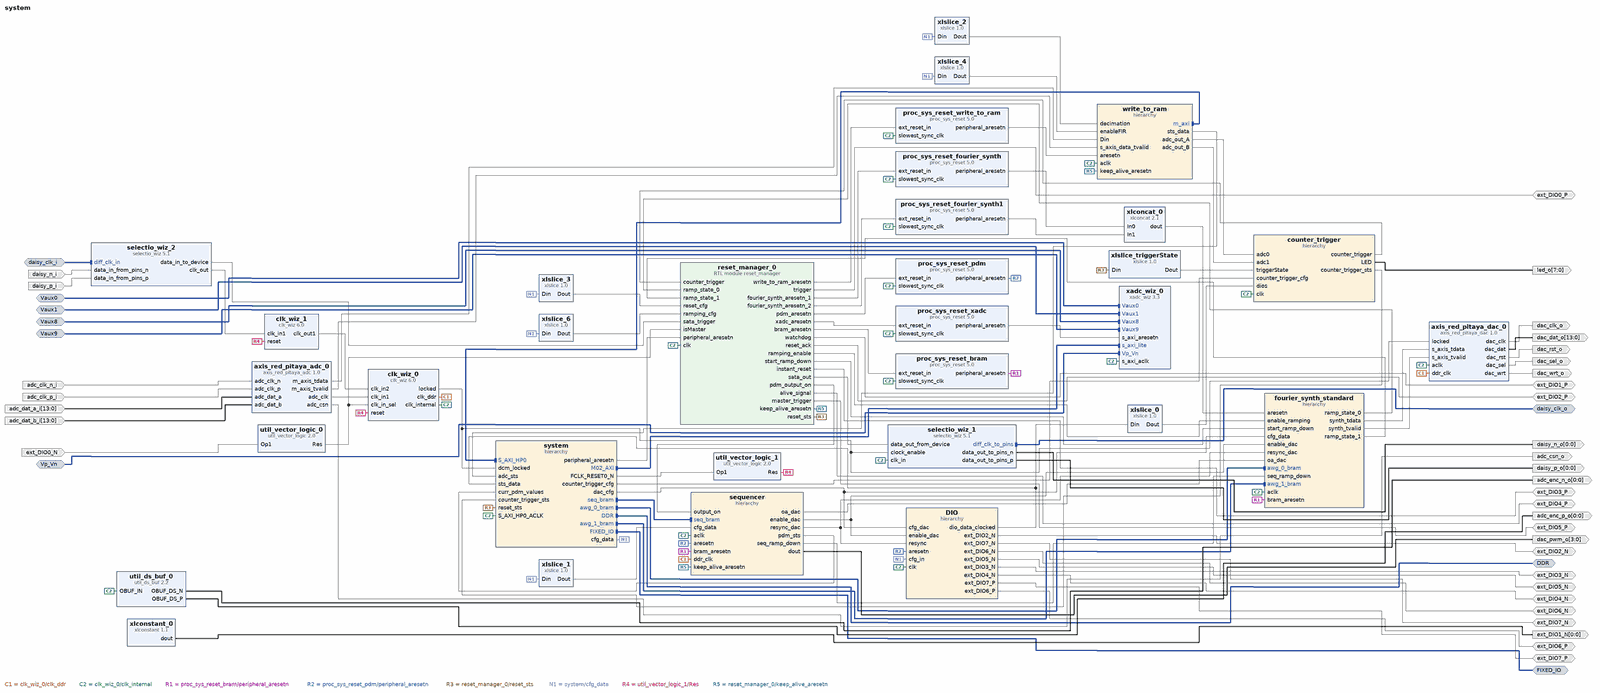
[diagram p0: block diagram of the top level, whole]
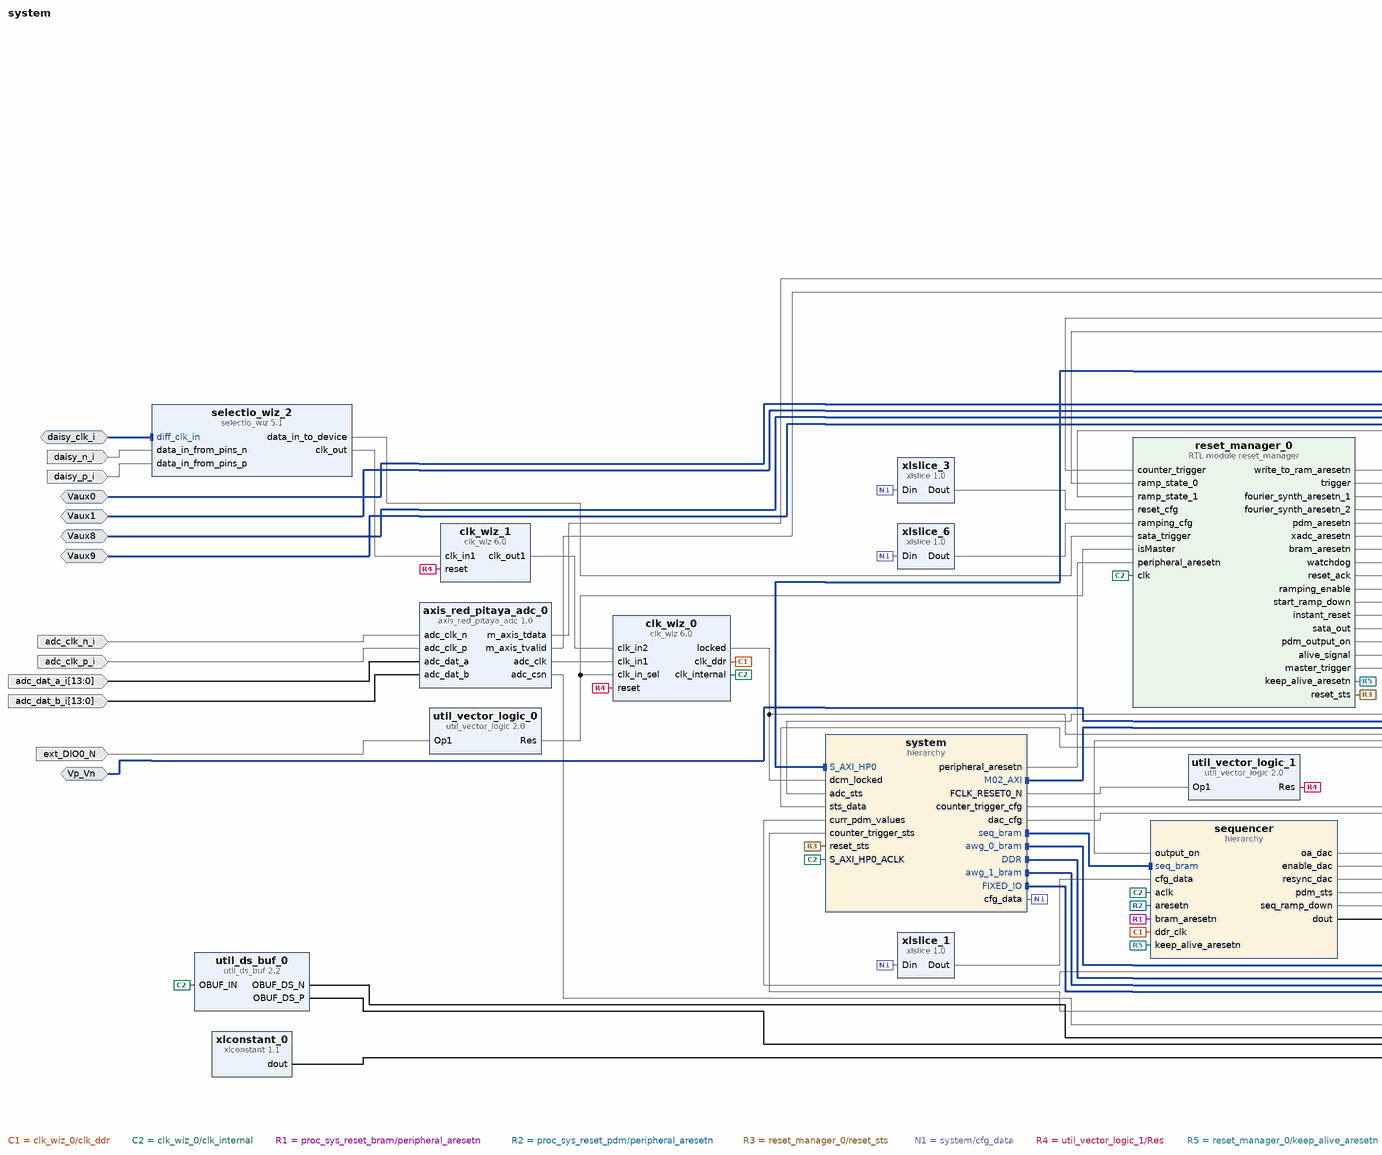
[diagram p1: block diagram of the top level, left part]
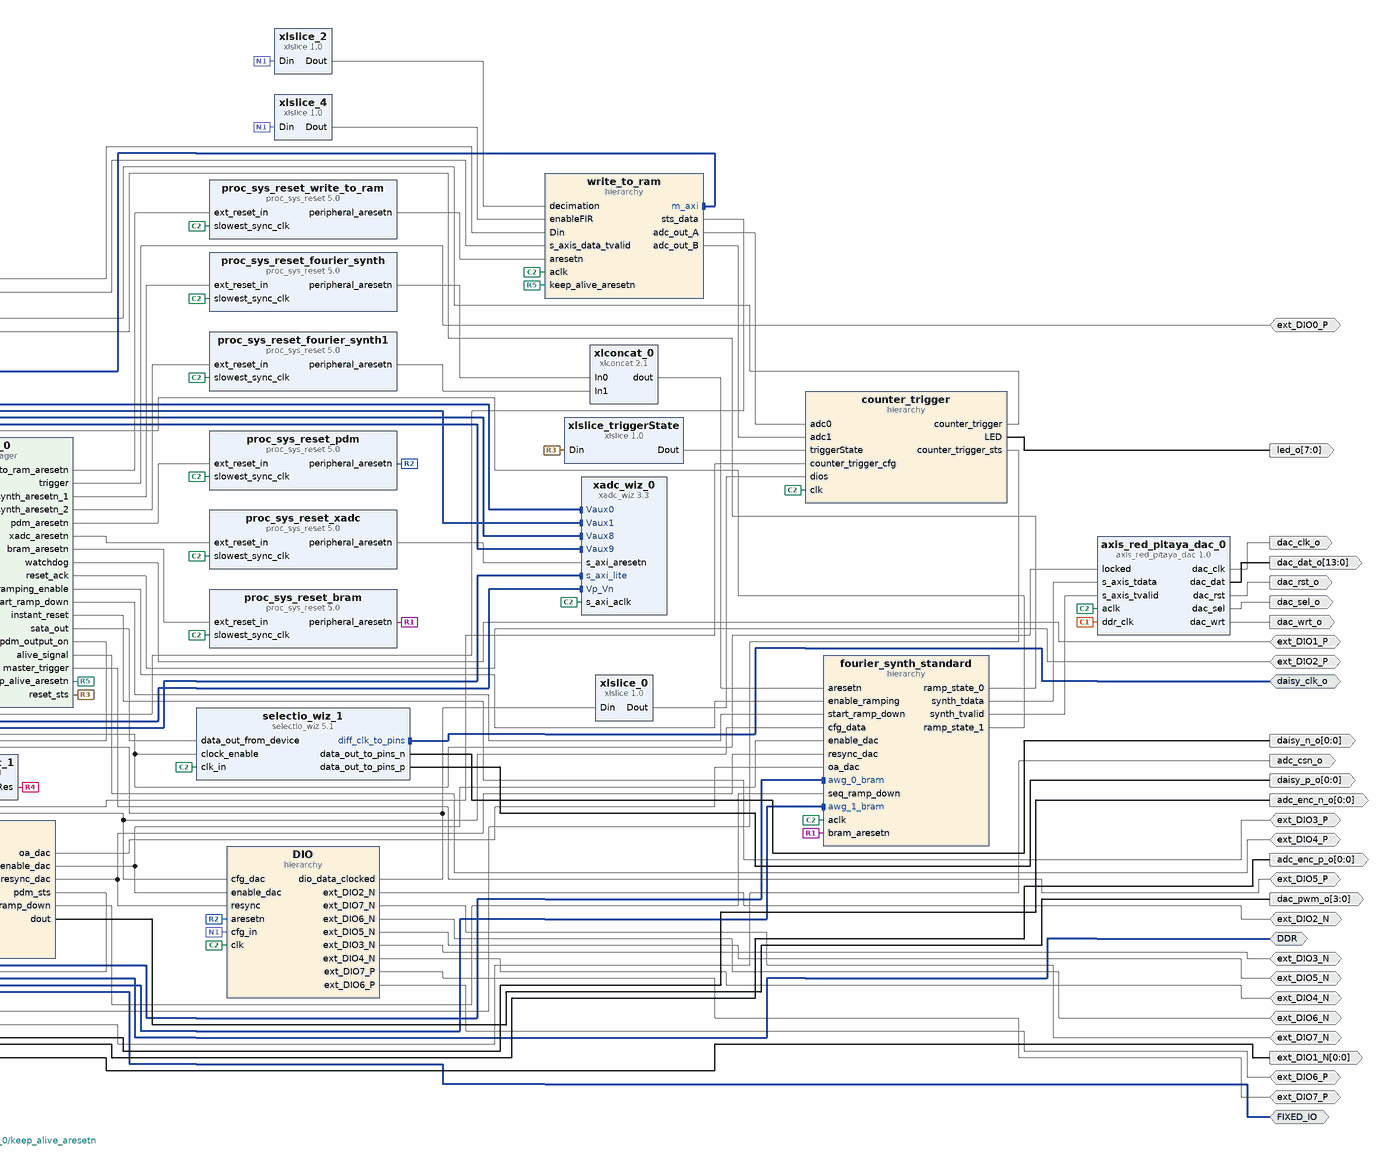
[diagram p2: block diagram of the top level, right part]
# Vivado block design system, xc7z010clg400-1, Vivado 2021.2
create_bd_design system

create_bd_intf_port -mode Master -vlnv xilinx.com:interface:ddrx_rtl:1.0 DDR
create_bd_intf_port -mode Master -vlnv xilinx.com:display_processing_system7:fixedio_rtl:1.0 FIXED_IO
create_bd_intf_port -mode Slave -vlnv xilinx.com:interface:diff_analog_io_rtl:1.0 Vaux0
create_bd_intf_port -mode Slave -vlnv xilinx.com:interface:diff_analog_io_rtl:1.0 Vaux1
create_bd_intf_port -mode Slave -vlnv xilinx.com:interface:diff_analog_io_rtl:1.0 Vaux8
create_bd_intf_port -mode Slave -vlnv xilinx.com:interface:diff_analog_io_rtl:1.0 Vaux9
create_bd_intf_port -mode Slave -vlnv xilinx.com:interface:diff_analog_io_rtl:1.0 Vp_Vn
create_bd_intf_port -mode Slave -vlnv xilinx.com:interface:diff_clock_rtl:1.0 daisy_clk_i
set_property -dict {CONFIG.FREQ_HZ 125000000} [get_bd_intf_ports daisy_clk_i]
create_bd_intf_port -mode Master -vlnv xilinx.com:interface:diff_clock_rtl:1.0 daisy_clk_o
create_bd_port -dir I adc_clk_n_i
create_bd_port -dir I adc_clk_p_i
create_bd_port -dir O adc_csn_o
create_bd_port -dir I -from 13 -to 0 adc_dat_a_i
create_bd_port -dir I -from 13 -to 0 adc_dat_b_i
create_bd_port -dir O -from 0 -to 0 adc_enc_n_o
create_bd_port -dir O -from 0 -to 0 adc_enc_p_o
create_bd_port -dir O dac_clk_o
create_bd_port -dir O -from 13 -to 0 dac_dat_o
create_bd_port -dir O -from 3 -to 0 dac_pwm_o
create_bd_port -dir O dac_rst_o
create_bd_port -dir O dac_sel_o
create_bd_port -dir O dac_wrt_o
create_bd_port -dir I daisy_n_i
create_bd_port -dir O -from 0 -to 0 daisy_n_o
create_bd_port -dir I daisy_p_i
create_bd_port -dir O -from 0 -to 0 daisy_p_o
create_bd_port -dir I ext_DIO0_N
create_bd_port -dir IO ext_DIO0_P
create_bd_port -dir O -from 0 -to 0 ext_DIO1_N
create_bd_port -dir IO ext_DIO1_P
create_bd_port -dir IO ext_DIO2_N
create_bd_port -dir IO ext_DIO2_P
create_bd_port -dir IO ext_DIO3_N
create_bd_port -dir IO ext_DIO3_P
create_bd_port -dir IO ext_DIO4_N
create_bd_port -dir IO ext_DIO4_P
create_bd_port -dir IO ext_DIO5_N
create_bd_port -dir IO ext_DIO5_P
create_bd_port -dir IO ext_DIO6_N
create_bd_port -dir IO ext_DIO6_P
create_bd_port -dir IO ext_DIO7_N
create_bd_port -dir IO ext_DIO7_P
create_bd_port -dir O -from 7 -to 0 led_o

create_bd_cell -type hier DIO
create_bd_cell -type ip -vlnv pavel-demin:user:axis_red_pitaya_adc:1.0 axis_red_pitaya_adc_0
create_bd_cell -type ip -vlnv pavel-demin:user:axis_red_pitaya_dac:1.0 axis_red_pitaya_dac_0
create_bd_cell -type ip -vlnv xilinx.com:ip:clk_wiz:6.0 clk_wiz_0
set_property -dict [list \
  CONFIG.CLKIN1_JITTER_PS 80.0 \
  CONFIG.CLKIN2_JITTER_PS 80.0 \
  CONFIG.CLKOUT1_JITTER 112.962 \
  CONFIG.CLKOUT1_PHASE_ERROR 112.379 \
  CONFIG.CLKOUT1_REQUESTED_OUT_FREQ 250.000 \
  CONFIG.CLKOUT2_JITTER 128.871 \
  CONFIG.CLKOUT2_PHASE_ERROR 112.379 \
  CONFIG.CLKOUT2_REQUESTED_OUT_FREQ 125.000 \
  CONFIG.CLKOUT2_USED true \
  CONFIG.CLKOUT3_JITTER 104.620 \
  CONFIG.CLKOUT3_PHASE_ERROR 112.379 \
  CONFIG.CLKOUT3_REQUESTED_OUT_FREQ 375.000 \
  CONFIG.CLKOUT3_USED true \
  CONFIG.CLKOUT4_JITTER 224.358 \
  CONFIG.CLKOUT4_PHASE_ERROR 112.379 \
  CONFIG.CLKOUT4_REQUESTED_OUT_FREQ 7.8125 \
  CONFIG.CLKOUT4_USED true \
  CONFIG.CLK_OUT1_PORT clk_ddr \
  CONFIG.CLK_OUT2_PORT clk_internal \
  CONFIG.CLK_OUT3_PORT clk_375MHz \
  CONFIG.CLK_OUT4_PORT clk_pdm \
  CONFIG.ENABLE_CLOCK_MONITOR false \
  CONFIG.MMCM_CLKFBOUT_MULT_F 6.000 \
  CONFIG.MMCM_CLKIN1_PERIOD 8.000 \
  CONFIG.MMCM_CLKIN2_PERIOD 8.000 \
  CONFIG.MMCM_CLKOUT0_DIVIDE_F 3.000 \
  CONFIG.MMCM_CLKOUT1_DIVIDE 6 \
  CONFIG.MMCM_CLKOUT2_DIVIDE 2 \
  CONFIG.MMCM_CLKOUT3_DIVIDE 96 \
  CONFIG.MMCM_DIVCLK_DIVIDE 1 \
  CONFIG.NUM_OUT_CLKS 4 \
  CONFIG.PRIMITIVE MMCM \
  CONFIG.PRIM_IN_FREQ 125.000 \
  CONFIG.PRIM_SOURCE Single_ended_clock_capable_pin \
  CONFIG.SECONDARY_IN_FREQ 125.000 \
  CONFIG.SECONDARY_SOURCE Single_ended_clock_capable_pin \
  CONFIG.USE_INCLK_SWITCHOVER true \
  CONFIG.USE_RESET true \
] [get_bd_cells clk_wiz_0]
create_bd_cell -type ip -vlnv xilinx.com:ip:clk_wiz:6.0 clk_wiz_1
set_property -dict [list \
  CONFIG.CLKIN1_JITTER_PS 80.0 \
  CONFIG.CLKOUT1_JITTER 119.348 \
  CONFIG.CLKOUT1_PHASE_ERROR 96.948 \
  CONFIG.CLKOUT1_REQUESTED_OUT_FREQ 125.000 \
  CONFIG.MMCM_CLKFBOUT_MULT_F 8.000 \
  CONFIG.MMCM_CLKIN1_PERIOD 8.000 \
  CONFIG.MMCM_CLKOUT0_DIVIDE_F 8.000 \
  CONFIG.MMCM_DIVCLK_DIVIDE 1 \
  CONFIG.PRIM_IN_FREQ 125.000 \
] [get_bd_cells clk_wiz_1]
create_bd_cell -type hier counter_trigger
create_bd_cell -type hier fourier_synth_standard
create_bd_cell -type ip -vlnv xilinx.com:ip:proc_sys_reset:5.0 proc_sys_reset_bram
create_bd_cell -type ip -vlnv xilinx.com:ip:proc_sys_reset:5.0 proc_sys_reset_fourier_synth
create_bd_cell -type ip -vlnv xilinx.com:ip:proc_sys_reset:5.0 proc_sys_reset_fourier_synth1
create_bd_cell -type ip -vlnv xilinx.com:ip:proc_sys_reset:5.0 proc_sys_reset_pdm
create_bd_cell -type ip -vlnv xilinx.com:ip:proc_sys_reset:5.0 proc_sys_reset_write_to_ram
create_bd_cell -type ip -vlnv xilinx.com:ip:proc_sys_reset:5.0 proc_sys_reset_xadc
create_bd_cell -type module -reference reset_manager reset_manager_0
create_bd_cell -type ip -vlnv xilinx.com:ip:selectio_wiz:5.1 selectio_wiz_1
set_property -dict [list \
  CONFIG.BUS_DIR OUTPUTS \
  CONFIG.BUS_IO_STD DIFF_HSTL_I_18 \
  CONFIG.BUS_SIG_TYPE DIFF \
  CONFIG.CLK_EN true \
  CONFIG.CLK_FWD true \
  CONFIG.CLK_FWD_IO_STD DIFF_HSTL_I_18 \
  CONFIG.CLK_FWD_SIG_TYPE DIFF \
  CONFIG.CONFIG_CLK_FWD false \
  CONFIG.SELIO_BUS_IN_DELAY NONE \
  CONFIG.SELIO_CLK_BUF MMCM \
  CONFIG.SELIO_CLK_IO_STD DIFF_HSTL_I_18 \
  CONFIG.SELIO_CLK_SIG_TYPE DIFF \
  CONFIG.SELIO_INTERFACE_TYPE NETWORKING \
  CONFIG.SERIALIZATION_FACTOR 4 \
  CONFIG.SYSTEM_DATA_WIDTH 1 \
] [get_bd_cells selectio_wiz_1]
create_bd_cell -type ip -vlnv xilinx.com:ip:selectio_wiz:5.1 selectio_wiz_2
set_property -dict [list \
  CONFIG.BUS_DIR INPUTS \
  CONFIG.BUS_IO_STD DIFF_HSTL_I_18 \
  CONFIG.BUS_SIG_TYPE DIFF \
  CONFIG.CLK_EN false \
  CONFIG.CLK_FWD false \
  CONFIG.CLK_FWD_IO_STD DIFF_HSTL_I_18 \
  CONFIG.CLK_FWD_SIG_TYPE DIFF \
  CONFIG.CONFIG_CLK_FWD false \
  CONFIG.SELIO_BUS_IN_DELAY NONE \
  CONFIG.SELIO_CLK_BUF BUFIO \
  CONFIG.SELIO_CLK_IO_STD DIFF_HSTL_I_18 \
  CONFIG.SELIO_CLK_SIG_TYPE DIFF \
  CONFIG.SELIO_INTERFACE_TYPE NETWORKING \
  CONFIG.SERIALIZATION_FACTOR 4 \
  CONFIG.SYSTEM_DATA_WIDTH 1 \
] [get_bd_cells selectio_wiz_2]
create_bd_cell -type hier sequencer
create_bd_cell -type hier system
create_bd_cell -type ip -vlnv xilinx.com:ip:util_ds_buf:2.2 util_ds_buf_0
set_property -dict {CONFIG.C_BUF_TYPE OBUFDS} [get_bd_cells util_ds_buf_0]
create_bd_cell -type ip -vlnv xilinx.com:ip:util_vector_logic:2.0 util_vector_logic_0
set_property -dict {CONFIG.C_OPERATION not CONFIG.C_SIZE 1} [get_bd_cells util_vector_logic_0]
create_bd_cell -type ip -vlnv xilinx.com:ip:util_vector_logic:2.0 util_vector_logic_1
set_property -dict {CONFIG.C_OPERATION not CONFIG.C_SIZE 1} [get_bd_cells util_vector_logic_1]
create_bd_cell -type hier write_to_ram
create_bd_cell -type ip -vlnv xilinx.com:ip:xadc_wiz:3.3 xadc_wiz_0
set_property -dict [list \
  CONFIG.ADC_CONVERSION_RATE 1000 \
  CONFIG.CHANNEL_ENABLE_VAUXP0_VAUXN0 true \
  CONFIG.CHANNEL_ENABLE_VAUXP1_VAUXN1 true \
  CONFIG.CHANNEL_ENABLE_VAUXP8_VAUXN8 true \
  CONFIG.CHANNEL_ENABLE_VAUXP9_VAUXN9 true \
  CONFIG.CHANNEL_ENABLE_VP_VN true \
  CONFIG.DCLK_FREQUENCY 125 \
  CONFIG.ENABLE_RESET false \
  CONFIG.EXTERNAL_MUX_CHANNEL VP_VN \
  CONFIG.INTERFACE_SELECTION Enable_AXI \
  CONFIG.SEQUENCER_MODE Off \
  CONFIG.SINGLE_CHANNEL_SELECTION TEMPERATURE \
  CONFIG.XADC_STARUP_SELECTION independent_adc \
] [get_bd_cells xadc_wiz_0]
create_bd_cell -type ip -vlnv xilinx.com:ip:xlconcat:2.1 xlconcat_0
create_bd_cell -type ip -vlnv xilinx.com:ip:xlconstant:1.1 xlconstant_0
set_property -dict {CONFIG.CONST_VAL 0} [get_bd_cells xlconstant_0]
create_bd_cell -type ip -vlnv xilinx.com:ip:xlslice:1.0 xlslice_0
set_property -dict {CONFIG.DIN_FROM 7 CONFIG.DOUT_WIDTH 8} [get_bd_cells xlslice_0]
create_bd_cell -type ip -vlnv xilinx.com:ip:xlslice:1.0 xlslice_1
set_property -dict {CONFIG.DIN_FROM 63 CONFIG.DIN_TO 32 CONFIG.DIN_WIDTH 128 CONFIG.DOUT_WIDTH 32} [get_bd_cells xlslice_1]
create_bd_cell -type ip -vlnv xilinx.com:ip:xlslice:1.0 xlslice_2
set_property -dict {CONFIG.DIN_FROM 31 CONFIG.DIN_TO 16 CONFIG.DIN_WIDTH 128 CONFIG.DOUT_WIDTH 16} [get_bd_cells xlslice_2]
create_bd_cell -type ip -vlnv xilinx.com:ip:xlslice:1.0 xlslice_3
set_property -dict {CONFIG.DIN_FROM 15 CONFIG.DIN_TO 8 CONFIG.DIN_WIDTH 128 CONFIG.DOUT_WIDTH 8} [get_bd_cells xlslice_3]
create_bd_cell -type ip -vlnv xilinx.com:ip:xlslice:1.0 xlslice_4
set_property -dict {CONFIG.DIN_FROM 15 CONFIG.DIN_TO 15 CONFIG.DIN_WIDTH 128 CONFIG.DOUT_WIDTH 1} [get_bd_cells xlslice_4]
create_bd_cell -type ip -vlnv xilinx.com:ip:xlslice:1.0 xlslice_6
set_property -dict {CONFIG.DIN_FROM 87 CONFIG.DIN_TO 80 CONFIG.DIN_WIDTH 128 CONFIG.DOUT_WIDTH 8} [get_bd_cells xlslice_6]
create_bd_cell -type ip -vlnv xilinx.com:ip:xlslice:1.0 xlslice_triggerState
set_property -dict {CONFIG.DIN_FROM 8 CONFIG.DIN_TO 8 CONFIG.DOUT_WIDTH 1} [get_bd_cells xlslice_triggerState]

# ---- hierarchy /DIO ----
current_bd_instance /DIO
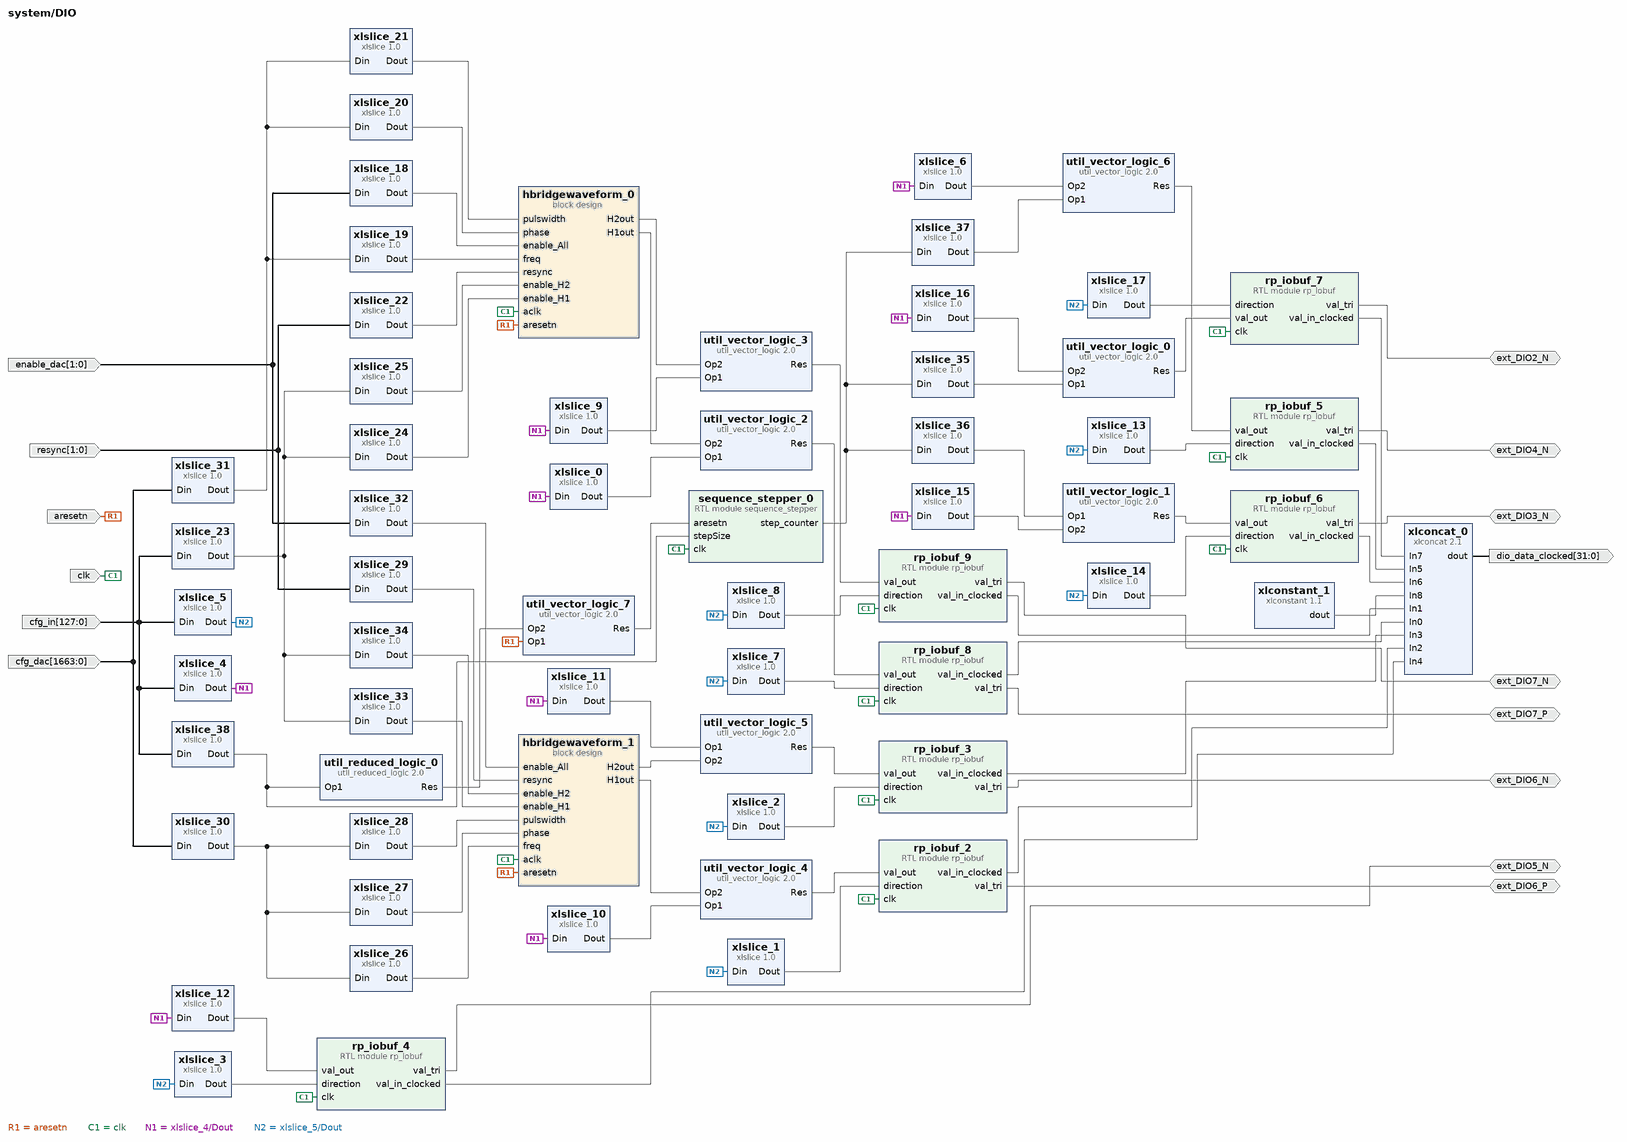
[diagram p3: block diagram inside /DIO]
create_bd_pin -dir I aresetn
create_bd_pin -dir I -from 1663 -to 0 cfg_dac
create_bd_pin -dir I -from 127 -to 0 cfg_in
create_bd_pin -dir I -type clk clk
create_bd_pin -dir O -from 31 -to 0 dio_data_clocked
create_bd_pin -dir I -from 1 -to 0 enable_dac
create_bd_pin -dir IO ext_DIO2_N
create_bd_pin -dir IO ext_DIO3_N
create_bd_pin -dir IO ext_DIO4_N
create_bd_pin -dir IO ext_DIO5_N
create_bd_pin -dir IO ext_DIO6_N
create_bd_pin -dir IO ext_DIO6_P
create_bd_pin -dir IO ext_DIO7_N
create_bd_pin -dir IO ext_DIO7_P
create_bd_pin -dir I -from 1 -to 0 resync

create_bd_cell -type container -reference hbridgewaveform hbridgewaveform_0
set_property -dict [list \
  CONFIG.ACTIVE_SIM_BD hbridgewaveform.bd \
  CONFIG.ACTIVE_SYNTH_BD hbridgewaveform.bd \
  CONFIG.ENABLE_DFX 0 \
  CONFIG.LIST_SIM_BD hbridgewaveform.bd \
  CONFIG.LIST_SYNTH_BD hbridgewaveform.bd \
  CONFIG.LOCK_PROPAGATE 0 \
] [get_bd_cells hbridgewaveform_0]
create_bd_cell -type container -reference hbridgewaveform hbridgewaveform_1
set_property -dict [list \
  CONFIG.ACTIVE_SIM_BD hbridgewaveform.bd \
  CONFIG.ACTIVE_SYNTH_BD hbridgewaveform.bd \
  CONFIG.ENABLE_DFX 0 \
  CONFIG.LIST_SIM_BD hbridgewaveform.bd \
  CONFIG.LIST_SYNTH_BD hbridgewaveform.bd \
  CONFIG.LOCK_PROPAGATE 0 \
] [get_bd_cells hbridgewaveform_1]
create_bd_cell -type module -reference rp_iobuf rp_iobuf_2
create_bd_cell -type module -reference rp_iobuf rp_iobuf_3
create_bd_cell -type module -reference rp_iobuf rp_iobuf_4
create_bd_cell -type module -reference rp_iobuf rp_iobuf_5
create_bd_cell -type module -reference rp_iobuf rp_iobuf_6
create_bd_cell -type module -reference rp_iobuf rp_iobuf_7
create_bd_cell -type module -reference rp_iobuf rp_iobuf_8
create_bd_cell -type module -reference rp_iobuf rp_iobuf_9
create_bd_cell -type module -reference sequence_stepper sequence_stepper_0
create_bd_cell -type ip -vlnv xilinx.com:ip:util_reduced_logic:2.0 util_reduced_logic_0
set_property -dict {CONFIG.C_OPERATION or CONFIG.C_SIZE 32} [get_bd_cells util_reduced_logic_0]
create_bd_cell -type ip -vlnv xilinx.com:ip:util_vector_logic:2.0 util_vector_logic_0
set_property -dict {CONFIG.C_OPERATION or CONFIG.C_SIZE 1} [get_bd_cells util_vector_logic_0]
create_bd_cell -type ip -vlnv xilinx.com:ip:util_vector_logic:2.0 util_vector_logic_1
set_property -dict {CONFIG.C_OPERATION or CONFIG.C_SIZE 1} [get_bd_cells util_vector_logic_1]
create_bd_cell -type ip -vlnv xilinx.com:ip:util_vector_logic:2.0 util_vector_logic_2
set_property -dict {CONFIG.C_OPERATION or CONFIG.C_SIZE 1} [get_bd_cells util_vector_logic_2]
create_bd_cell -type ip -vlnv xilinx.com:ip:util_vector_logic:2.0 util_vector_logic_3
set_property -dict {CONFIG.C_OPERATION or CONFIG.C_SIZE 1} [get_bd_cells util_vector_logic_3]
create_bd_cell -type ip -vlnv xilinx.com:ip:util_vector_logic:2.0 util_vector_logic_4
set_property -dict {CONFIG.C_OPERATION or CONFIG.C_SIZE 1} [get_bd_cells util_vector_logic_4]
create_bd_cell -type ip -vlnv xilinx.com:ip:util_vector_logic:2.0 util_vector_logic_5
set_property -dict {CONFIG.C_OPERATION or CONFIG.C_SIZE 1} [get_bd_cells util_vector_logic_5]
create_bd_cell -type ip -vlnv xilinx.com:ip:util_vector_logic:2.0 util_vector_logic_6
set_property -dict {CONFIG.C_OPERATION or CONFIG.C_SIZE 1} [get_bd_cells util_vector_logic_6]
create_bd_cell -type ip -vlnv xilinx.com:ip:util_vector_logic:2.0 util_vector_logic_7
set_property -dict {CONFIG.C_OPERATION and CONFIG.C_SIZE 1} [get_bd_cells util_vector_logic_7]
create_bd_cell -type ip -vlnv xilinx.com:ip:xlconcat:2.1 xlconcat_0
set_property -dict {CONFIG.NUM_PORTS 9} [get_bd_cells xlconcat_0]
create_bd_cell -type ip -vlnv xilinx.com:ip:xlconstant:1.1 xlconstant_1
set_property -dict {CONFIG.CONST_VAL 0 CONFIG.CONST_WIDTH 24} [get_bd_cells xlconstant_1]
create_bd_cell -type ip -vlnv xilinx.com:ip:xlslice:1.0 xlslice_0
set_property -dict {CONFIG.DIN_WIDTH 8} [get_bd_cells xlslice_0]
create_bd_cell -type ip -vlnv xilinx.com:ip:xlslice:1.0 xlslice_1
set_property -dict {CONFIG.DIN_FROM 2 CONFIG.DIN_TO 2 CONFIG.DIN_WIDTH 8 CONFIG.DOUT_WIDTH 1} [get_bd_cells xlslice_1]
create_bd_cell -type ip -vlnv xilinx.com:ip:xlslice:1.0 xlslice_2
set_property -dict {CONFIG.DIN_FROM 3 CONFIG.DIN_TO 3 CONFIG.DIN_WIDTH 8 CONFIG.DOUT_WIDTH 1} [get_bd_cells xlslice_2]
create_bd_cell -type ip -vlnv xilinx.com:ip:xlslice:1.0 xlslice_3
set_property -dict {CONFIG.DIN_FROM 4 CONFIG.DIN_TO 4 CONFIG.DIN_WIDTH 8 CONFIG.DOUT_WIDTH 1} [get_bd_cells xlslice_3]
create_bd_cell -type ip -vlnv xilinx.com:ip:xlslice:1.0 xlslice_4
set_property -dict {CONFIG.DIN_FROM 71 CONFIG.DIN_TO 64 CONFIG.DIN_WIDTH 128 CONFIG.DOUT_WIDTH 8} [get_bd_cells xlslice_4]
create_bd_cell -type ip -vlnv xilinx.com:ip:xlslice:1.0 xlslice_5
set_property -dict {CONFIG.DIN_FROM 79 CONFIG.DIN_TO 72 CONFIG.DIN_WIDTH 128 CONFIG.DOUT_WIDTH 8} [get_bd_cells xlslice_5]
create_bd_cell -type ip -vlnv xilinx.com:ip:xlslice:1.0 xlslice_6
set_property -dict {CONFIG.DIN_FROM 5 CONFIG.DIN_TO 5 CONFIG.DIN_WIDTH 8 CONFIG.DOUT_WIDTH 1} [get_bd_cells xlslice_6]
create_bd_cell -type ip -vlnv xilinx.com:ip:xlslice:1.0 xlslice_7
set_property -dict {CONFIG.DIN_WIDTH 8} [get_bd_cells xlslice_7]
create_bd_cell -type ip -vlnv xilinx.com:ip:xlslice:1.0 xlslice_8
set_property -dict {CONFIG.DIN_FROM 1 CONFIG.DIN_TO 1 CONFIG.DIN_WIDTH 8 CONFIG.DOUT_WIDTH 1} [get_bd_cells xlslice_8]
create_bd_cell -type ip -vlnv xilinx.com:ip:xlslice:1.0 xlslice_9
set_property -dict {CONFIG.DIN_FROM 1 CONFIG.DIN_TO 1 CONFIG.DIN_WIDTH 8 CONFIG.DOUT_WIDTH 1} [get_bd_cells xlslice_9]
create_bd_cell -type ip -vlnv xilinx.com:ip:xlslice:1.0 xlslice_10
set_property -dict {CONFIG.DIN_FROM 2 CONFIG.DIN_TO 2 CONFIG.DIN_WIDTH 8 CONFIG.DOUT_WIDTH 1} [get_bd_cells xlslice_10]
create_bd_cell -type ip -vlnv xilinx.com:ip:xlslice:1.0 xlslice_11
set_property -dict {CONFIG.DIN_FROM 3 CONFIG.DIN_TO 3 CONFIG.DIN_WIDTH 8 CONFIG.DOUT_WIDTH 1} [get_bd_cells xlslice_11]
create_bd_cell -type ip -vlnv xilinx.com:ip:xlslice:1.0 xlslice_12
set_property -dict {CONFIG.DIN_FROM 4 CONFIG.DIN_TO 4 CONFIG.DIN_WIDTH 8 CONFIG.DOUT_WIDTH 1} [get_bd_cells xlslice_12]
create_bd_cell -type ip -vlnv xilinx.com:ip:xlslice:1.0 xlslice_13
set_property -dict {CONFIG.DIN_FROM 5 CONFIG.DIN_TO 5 CONFIG.DIN_WIDTH 8 CONFIG.DOUT_WIDTH 1} [get_bd_cells xlslice_13]
create_bd_cell -type ip -vlnv xilinx.com:ip:xlslice:1.0 xlslice_14
set_property -dict {CONFIG.DIN_FROM 6 CONFIG.DIN_TO 6 CONFIG.DIN_WIDTH 8 CONFIG.DOUT_WIDTH 1} [get_bd_cells xlslice_14]
create_bd_cell -type ip -vlnv xilinx.com:ip:xlslice:1.0 xlslice_15
set_property -dict {CONFIG.DIN_FROM 6 CONFIG.DIN_TO 6 CONFIG.DIN_WIDTH 8 CONFIG.DOUT_WIDTH 1} [get_bd_cells xlslice_15]
create_bd_cell -type ip -vlnv xilinx.com:ip:xlslice:1.0 xlslice_16
set_property -dict {CONFIG.DIN_FROM 7 CONFIG.DIN_TO 7 CONFIG.DIN_WIDTH 8 CONFIG.DOUT_WIDTH 1} [get_bd_cells xlslice_16]
create_bd_cell -type ip -vlnv xilinx.com:ip:xlslice:1.0 xlslice_17
set_property -dict {CONFIG.DIN_FROM 7 CONFIG.DIN_TO 7 CONFIG.DIN_WIDTH 8 CONFIG.DOUT_WIDTH 1} [get_bd_cells xlslice_17]
create_bd_cell -type ip -vlnv xilinx.com:ip:xlslice:1.0 xlslice_18
set_property -dict {CONFIG.DIN_WIDTH 2} [get_bd_cells xlslice_18]
create_bd_cell -type ip -vlnv xilinx.com:ip:xlslice:1.0 xlslice_19
set_property -dict {CONFIG.DIN_FROM 175 CONFIG.DIN_TO 128 CONFIG.DIN_WIDTH 832 CONFIG.DOUT_WIDTH 48} [get_bd_cells xlslice_19]
create_bd_cell -type ip -vlnv xilinx.com:ip:xlslice:1.0 xlslice_20
set_property -dict {CONFIG.DIN_FROM 239 CONFIG.DIN_TO 192 CONFIG.DIN_WIDTH 832 CONFIG.DOUT_WIDTH 48} [get_bd_cells xlslice_20]
create_bd_cell -type ip -vlnv xilinx.com:ip:xlslice:1.0 xlslice_21
set_property -dict {CONFIG.DIN_FROM 127 CONFIG.DIN_TO 112 CONFIG.DIN_WIDTH 832 CONFIG.DOUT_WIDTH 16} [get_bd_cells xlslice_21]
create_bd_cell -type ip -vlnv xilinx.com:ip:xlslice:1.0 xlslice_22
set_property -dict {CONFIG.DIN_WIDTH 2} [get_bd_cells xlslice_22]
create_bd_cell -type ip -vlnv xilinx.com:ip:xlslice:1.0 xlslice_23
set_property -dict {CONFIG.DIN_FROM 95 CONFIG.DIN_TO 88 CONFIG.DIN_WIDTH 128 CONFIG.DOUT_WIDTH 8} [get_bd_cells xlslice_23]
create_bd_cell -type ip -vlnv xilinx.com:ip:xlslice:1.0 xlslice_24
set_property -dict {CONFIG.DIN_WIDTH 8} [get_bd_cells xlslice_24]
create_bd_cell -type ip -vlnv xilinx.com:ip:xlslice:1.0 xlslice_25
set_property -dict {CONFIG.DIN_FROM 1 CONFIG.DIN_TO 1 CONFIG.DIN_WIDTH 8 CONFIG.DOUT_WIDTH 1} [get_bd_cells xlslice_25]
create_bd_cell -type ip -vlnv xilinx.com:ip:xlslice:1.0 xlslice_26
set_property -dict {CONFIG.DIN_FROM 175 CONFIG.DIN_TO 128 CONFIG.DIN_WIDTH 832 CONFIG.DOUT_WIDTH 48} [get_bd_cells xlslice_26]
create_bd_cell -type ip -vlnv xilinx.com:ip:xlslice:1.0 xlslice_27
set_property -dict {CONFIG.DIN_FROM 239 CONFIG.DIN_TO 192 CONFIG.DIN_WIDTH 832 CONFIG.DOUT_WIDTH 48} [get_bd_cells xlslice_27]
create_bd_cell -type ip -vlnv xilinx.com:ip:xlslice:1.0 xlslice_28
set_property -dict {CONFIG.DIN_FROM 127 CONFIG.DIN_TO 112 CONFIG.DIN_WIDTH 832 CONFIG.DOUT_WIDTH 16} [get_bd_cells xlslice_28]
create_bd_cell -type ip -vlnv xilinx.com:ip:xlslice:1.0 xlslice_29
set_property -dict {CONFIG.DIN_FROM 1 CONFIG.DIN_TO 1 CONFIG.DIN_WIDTH 2 CONFIG.DOUT_WIDTH 1} [get_bd_cells xlslice_29]
create_bd_cell -type ip -vlnv xilinx.com:ip:xlslice:1.0 xlslice_30
set_property -dict {CONFIG.DIN_FROM 1663 CONFIG.DIN_TO 832 CONFIG.DIN_WIDTH 1664 CONFIG.DOUT_WIDTH 832} [get_bd_cells xlslice_30]
create_bd_cell -type ip -vlnv xilinx.com:ip:xlslice:1.0 xlslice_31
set_property -dict {CONFIG.DIN_FROM 831 CONFIG.DIN_TO 0 CONFIG.DIN_WIDTH 1664 CONFIG.DOUT_WIDTH 832} [get_bd_cells xlslice_31]
create_bd_cell -type ip -vlnv xilinx.com:ip:xlslice:1.0 xlslice_32
set_property -dict {CONFIG.DIN_FROM 1 CONFIG.DIN_TO 1 CONFIG.DIN_WIDTH 2 CONFIG.DOUT_WIDTH 1} [get_bd_cells xlslice_32]
create_bd_cell -type ip -vlnv xilinx.com:ip:xlslice:1.0 xlslice_33
set_property -dict {CONFIG.DIN_FROM 2 CONFIG.DIN_TO 2 CONFIG.DIN_WIDTH 8 CONFIG.DOUT_WIDTH 1} [get_bd_cells xlslice_33]
create_bd_cell -type ip -vlnv xilinx.com:ip:xlslice:1.0 xlslice_34
set_property -dict {CONFIG.DIN_FROM 3 CONFIG.DIN_TO 3 CONFIG.DIN_WIDTH 8 CONFIG.DOUT_WIDTH 1} [get_bd_cells xlslice_34]
create_bd_cell -type ip -vlnv xilinx.com:ip:xlslice:1.0 xlslice_35
set_property -dict {CONFIG.DIN_WIDTH 32} [get_bd_cells xlslice_35]
create_bd_cell -type ip -vlnv xilinx.com:ip:xlslice:1.0 xlslice_36
set_property -dict {CONFIG.DIN_FROM 1 CONFIG.DIN_TO 1 CONFIG.DIN_WIDTH 32 CONFIG.DOUT_WIDTH 1} [get_bd_cells xlslice_36]
create_bd_cell -type ip -vlnv xilinx.com:ip:xlslice:1.0 xlslice_37
set_property -dict {CONFIG.DIN_FROM 2 CONFIG.DIN_TO 2 CONFIG.DIN_WIDTH 32} [get_bd_cells xlslice_37]
create_bd_cell -type ip -vlnv xilinx.com:ip:xlslice:1.0 xlslice_38
set_property -dict {CONFIG.DIN_FROM 127 CONFIG.DIN_TO 96 CONFIG.DIN_WIDTH 128 CONFIG.DOUT_WIDTH 32} [get_bd_cells xlslice_38]

# ---- hierarchy /counter_trigger ----
current_bd_instance /counter_trigger
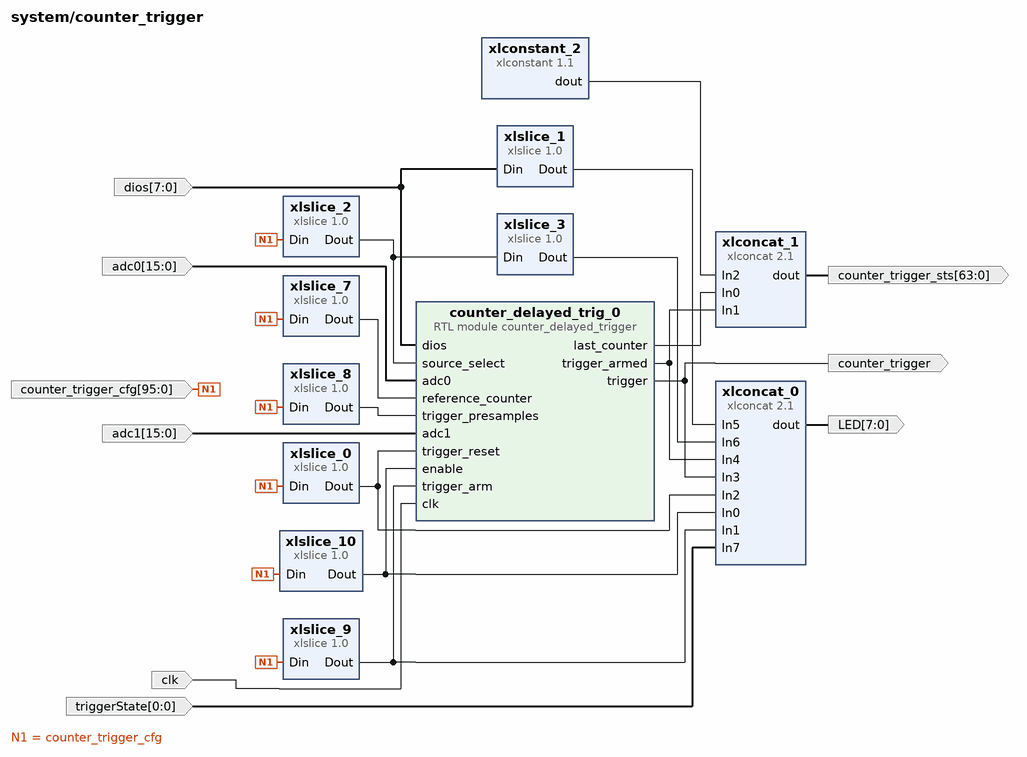
[diagram p4: block diagram inside /counter_trigger]
create_bd_pin -dir O -from 7 -to 0 LED
create_bd_pin -dir I -from 15 -to 0 adc0
create_bd_pin -dir I -from 15 -to 0 adc1
create_bd_pin -dir I clk
create_bd_pin -dir O counter_trigger
create_bd_pin -dir I -from 95 -to 0 counter_trigger_cfg
create_bd_pin -dir O -from 63 -to 0 counter_trigger_sts
create_bd_pin -dir I -from 7 -to 0 dios
create_bd_pin -dir I -from 0 -to 0 triggerState

create_bd_cell -type module -reference counter_delayed_trigger counter_delayed_trig_0
create_bd_cell -type ip -vlnv xilinx.com:ip:xlconcat:2.1 xlconcat_0
set_property -dict [list \
  CONFIG.IN0_WIDTH 1 \
  CONFIG.IN1_WIDTH 1 \
  CONFIG.IN2_WIDTH 1 \
  CONFIG.IN3_WIDTH 1 \
  CONFIG.IN4_WIDTH 1 \
  CONFIG.IN5_WIDTH 1 \
  CONFIG.IN6_WIDTH 1 \
  CONFIG.IN7_WIDTH 1 \
  CONFIG.NUM_PORTS 8 \
] [get_bd_cells xlconcat_0]
create_bd_cell -type ip -vlnv xilinx.com:ip:xlconcat:2.1 xlconcat_1
set_property -dict {CONFIG.IN0_WIDTH 32 CONFIG.IN1_WIDTH 1 CONFIG.IN2_WIDTH 31 CONFIG.NUM_PORTS 3} [get_bd_cells xlconcat_1]
create_bd_cell -type ip -vlnv xilinx.com:ip:xlconstant:1.1 xlconstant_2
set_property -dict {CONFIG.CONST_VAL 0 CONFIG.CONST_WIDTH 31} [get_bd_cells xlconstant_2]
create_bd_cell -type ip -vlnv xilinx.com:ip:xlslice:1.0 xlslice_0
set_property -dict {CONFIG.DIN_FROM 66 CONFIG.DIN_TO 66 CONFIG.DIN_WIDTH 96 CONFIG.DOUT_WIDTH 1} [get_bd_cells xlslice_0]
create_bd_cell -type ip -vlnv xilinx.com:ip:xlslice:1.0 xlslice_1
set_property -dict {CONFIG.DIN_WIDTH 8} [get_bd_cells xlslice_1]
create_bd_cell -type ip -vlnv xilinx.com:ip:xlslice:1.0 xlslice_2
set_property -dict {CONFIG.DIN_FROM 71 CONFIG.DIN_TO 67 CONFIG.DIN_WIDTH 96 CONFIG.DOUT_WIDTH 5} [get_bd_cells xlslice_2]
create_bd_cell -type ip -vlnv xilinx.com:ip:xlslice:1.0 xlslice_3
set_property -dict {CONFIG.DIN_FROM 4 CONFIG.DIN_TO 4 CONFIG.DIN_WIDTH 5 CONFIG.DOUT_WIDTH 1} [get_bd_cells xlslice_3]
create_bd_cell -type ip -vlnv xilinx.com:ip:xlslice:1.0 xlslice_7
set_property -dict {CONFIG.DIN_FROM 31 CONFIG.DIN_WIDTH 96 CONFIG.DOUT_WIDTH 32} [get_bd_cells xlslice_7]
create_bd_cell -type ip -vlnv xilinx.com:ip:xlslice:1.0 xlslice_8
set_property -dict {CONFIG.DIN_FROM 63 CONFIG.DIN_TO 32 CONFIG.DIN_WIDTH 96 CONFIG.DOUT_WIDTH 32} [get_bd_cells xlslice_8]
create_bd_cell -type ip -vlnv xilinx.com:ip:xlslice:1.0 xlslice_9
set_property -dict {CONFIG.DIN_FROM 65 CONFIG.DIN_TO 65 CONFIG.DIN_WIDTH 96 CONFIG.DOUT_WIDTH 1} [get_bd_cells xlslice_9]
create_bd_cell -type ip -vlnv xilinx.com:ip:xlslice:1.0 xlslice_10
set_property -dict {CONFIG.DIN_FROM 64 CONFIG.DIN_TO 64 CONFIG.DIN_WIDTH 96 CONFIG.DOUT_WIDTH 1} [get_bd_cells xlslice_10]

# ---- hierarchy /fourier_synth_standard ----
current_bd_instance /fourier_synth_standard
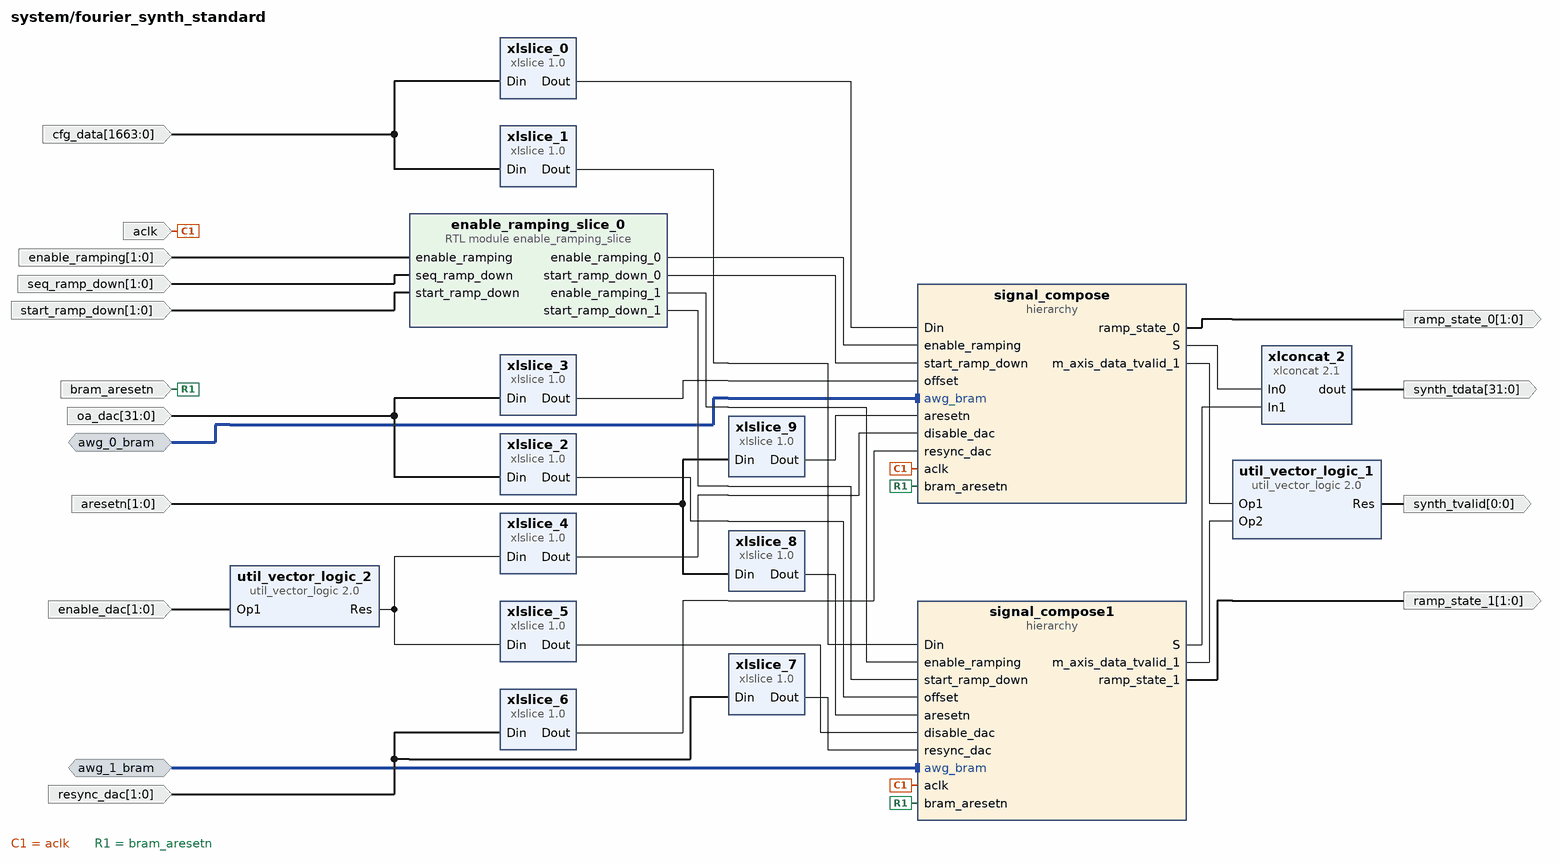
[diagram p5: block diagram inside /fourier_synth_standard]
create_bd_intf_pin -mode Slave -vlnv xilinx.com:interface:aximm_rtl:1.0 awg_0_bram
create_bd_intf_pin -mode Slave -vlnv xilinx.com:interface:aximm_rtl:1.0 awg_1_bram
create_bd_pin -dir I -type clk aclk
create_bd_pin -dir I -from 1 -to 0 aresetn
create_bd_pin -dir I bram_aresetn
create_bd_pin -dir I -from 1663 -to 0 cfg_data
create_bd_pin -dir I -from 1 -to 0 enable_dac
create_bd_pin -dir I -from 1 -to 0 enable_ramping
create_bd_pin -dir I -from 31 -to 0 oa_dac
create_bd_pin -dir O -from 1 -to 0 ramp_state_0
create_bd_pin -dir O -from 1 -to 0 ramp_state_1
create_bd_pin -dir I -from 1 -to 0 resync_dac
create_bd_pin -dir I -from 1 -to 0 seq_ramp_down
create_bd_pin -dir I -from 1 -to 0 start_ramp_down
create_bd_pin -dir O -from 31 -to 0 synth_tdata
create_bd_pin -dir O -from 0 -to 0 synth_tvalid

create_bd_cell -type module -reference enable_ramping_slice enable_ramping_slice_0
create_bd_cell -type hier signal_compose
create_bd_cell -type hier signal_compose1
create_bd_cell -type ip -vlnv xilinx.com:ip:util_vector_logic:2.0 util_vector_logic_1
set_property -dict {CONFIG.C_SIZE 1} [get_bd_cells util_vector_logic_1]
create_bd_cell -type ip -vlnv xilinx.com:ip:util_vector_logic:2.0 util_vector_logic_2
set_property -dict {CONFIG.C_OPERATION not CONFIG.C_SIZE 2} [get_bd_cells util_vector_logic_2]
create_bd_cell -type ip -vlnv xilinx.com:ip:xlconcat:2.1 xlconcat_2
create_bd_cell -type ip -vlnv xilinx.com:ip:xlslice:1.0 xlslice_0
set_property -dict {CONFIG.DIN_FROM 831 CONFIG.DIN_TO 0 CONFIG.DIN_WIDTH 1664 CONFIG.DOUT_WIDTH 832} [get_bd_cells xlslice_0]
create_bd_cell -type ip -vlnv xilinx.com:ip:xlslice:1.0 xlslice_1
set_property -dict {CONFIG.DIN_FROM 1663 CONFIG.DIN_TO 832 CONFIG.DIN_WIDTH 1664 CONFIG.DOUT_WIDTH 832} [get_bd_cells xlslice_1]
create_bd_cell -type ip -vlnv xilinx.com:ip:xlslice:1.0 xlslice_2
set_property -dict {CONFIG.DIN_FROM 31 CONFIG.DIN_TO 16 CONFIG.DIN_WIDTH 32 CONFIG.DOUT_WIDTH 16} [get_bd_cells xlslice_2]
create_bd_cell -type ip -vlnv xilinx.com:ip:xlslice:1.0 xlslice_3
set_property -dict {CONFIG.DIN_FROM 15 CONFIG.DIN_TO 0 CONFIG.DIN_WIDTH 32 CONFIG.DOUT_WIDTH 16} [get_bd_cells xlslice_3]
create_bd_cell -type ip -vlnv xilinx.com:ip:xlslice:1.0 xlslice_4
set_property -dict {CONFIG.DIN_FROM 0 CONFIG.DIN_TO 0 CONFIG.DIN_WIDTH 2} [get_bd_cells xlslice_4]
create_bd_cell -type ip -vlnv xilinx.com:ip:xlslice:1.0 xlslice_5
set_property -dict {CONFIG.DIN_FROM 1 CONFIG.DIN_TO 1 CONFIG.DIN_WIDTH 2 CONFIG.DOUT_WIDTH 1} [get_bd_cells xlslice_5]
create_bd_cell -type ip -vlnv xilinx.com:ip:xlslice:1.0 xlslice_6
set_property -dict {CONFIG.DIN_FROM 0 CONFIG.DIN_TO 0 CONFIG.DIN_WIDTH 2} [get_bd_cells xlslice_6]
create_bd_cell -type ip -vlnv xilinx.com:ip:xlslice:1.0 xlslice_7
set_property -dict {CONFIG.DIN_FROM 1 CONFIG.DIN_TO 1 CONFIG.DIN_WIDTH 2 CONFIG.DOUT_WIDTH 1} [get_bd_cells xlslice_7]
create_bd_cell -type ip -vlnv xilinx.com:ip:xlslice:1.0 xlslice_8
set_property -dict {CONFIG.DIN_FROM 1 CONFIG.DIN_TO 1 CONFIG.DIN_WIDTH 2 CONFIG.DOUT_WIDTH 1} [get_bd_cells xlslice_8]
create_bd_cell -type ip -vlnv xilinx.com:ip:xlslice:1.0 xlslice_9
set_property -dict {CONFIG.DIN_FROM 0 CONFIG.DIN_TO 0 CONFIG.DIN_WIDTH 2 CONFIG.DOUT_WIDTH 1} [get_bd_cells xlslice_9]

# ---- hierarchy /fourier_synth_standard/signal_compose ----
current_bd_instance /fourier_synth_standard/signal_compose
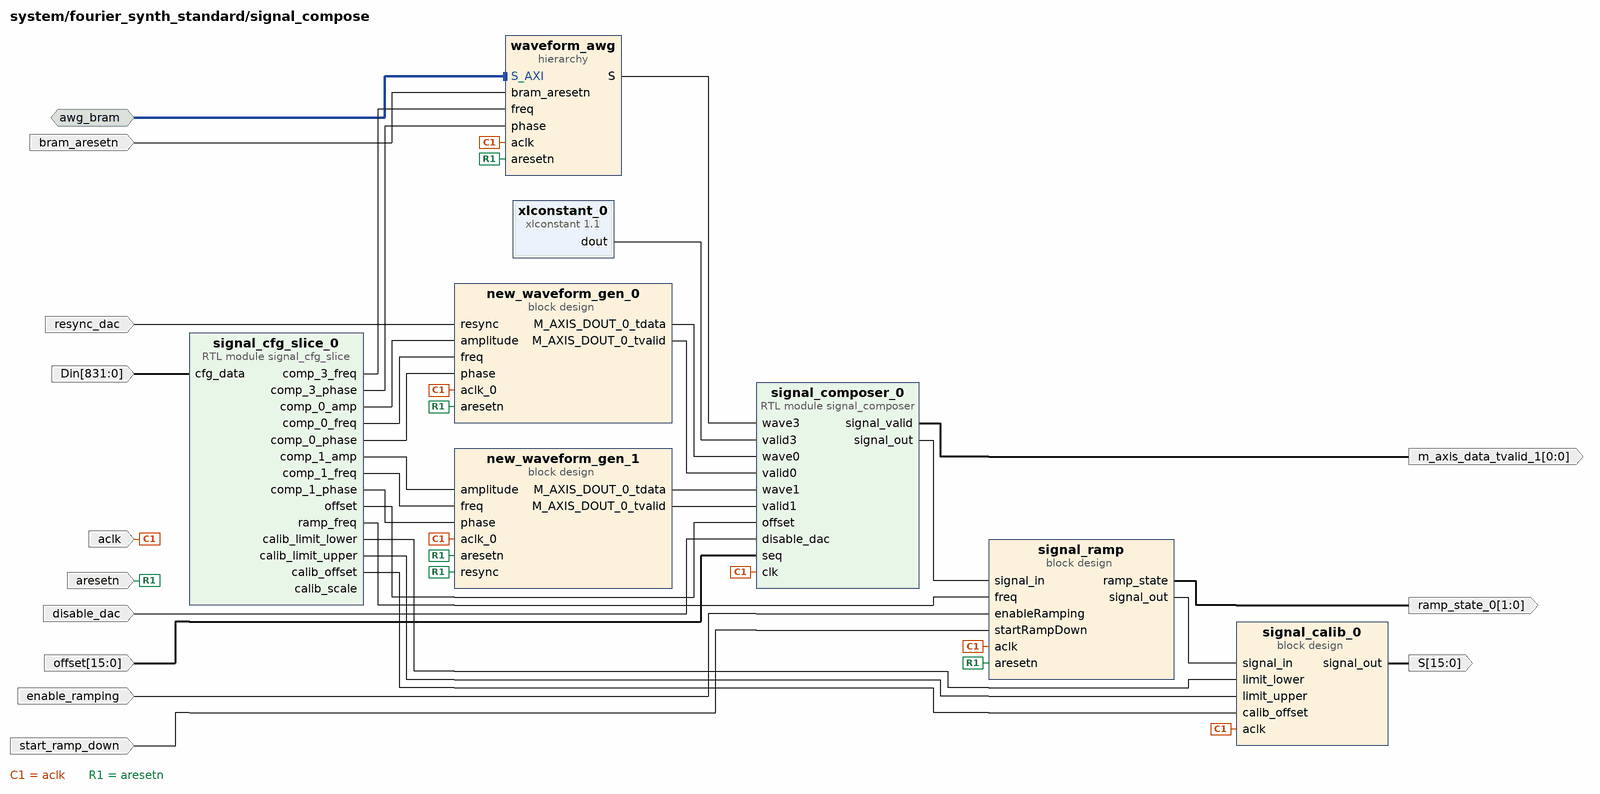
[diagram p6: block diagram inside /fourier_synth_standard/signal_compose]
create_bd_intf_pin -mode Slave -vlnv xilinx.com:interface:aximm_rtl:1.0 awg_bram
create_bd_pin -dir I -from 831 -to 0 Din
create_bd_pin -dir O -from 15 -to 0 -type data S
create_bd_pin -dir I -type clk aclk
create_bd_pin -dir I -type rst aresetn
create_bd_pin -dir I bram_aresetn
create_bd_pin -dir I disable_dac
create_bd_pin -dir I enable_ramping
create_bd_pin -dir O -from 0 -to 0 m_axis_data_tvalid_1
create_bd_pin -dir I -from 15 -to 0 offset
create_bd_pin -dir O -from 1 -to 0 ramp_state_0
create_bd_pin -dir I resync_dac
create_bd_pin -dir I start_ramp_down

create_bd_cell -type container -reference signal_calib signal_calib_0
set_property -dict [list \
  CONFIG.ACTIVE_SIM_BD signal_calib.bd \
  CONFIG.ACTIVE_SYNTH_BD signal_calib.bd \
  CONFIG.ENABLE_DFX 0 \
  CONFIG.LIST_SIM_BD signal_calib.bd \
  CONFIG.LIST_SYNTH_BD signal_calib.bd \
  CONFIG.LOCK_PROPAGATE 0 \
] [get_bd_cells signal_calib_0]
create_bd_cell -type module -reference signal_cfg_slice signal_cfg_slice_0
create_bd_cell -type module -reference signal_composer signal_composer_0
create_bd_cell -type container -reference signal_ramp signal_ramp
set_property -dict [list \
  CONFIG.ACTIVE_SIM_BD signal_ramp.bd \
  CONFIG.ACTIVE_SYNTH_BD signal_ramp.bd \
  CONFIG.ENABLE_DFX false \
  CONFIG.LIST_SIM_BD signal_ramp.bd \
  CONFIG.LIST_SYNTH_BD signal_ramp.bd \
  CONFIG.LOCK_PROPAGATE 0 \
] [get_bd_cells signal_ramp]
create_bd_cell -type hier waveform_awg
create_bd_cell -type ip -vlnv xilinx.com:ip:xlconstant:1.1 xlconstant_0
create_bd_cell -type container -reference new_waveform_gen new_waveform_gen_0
set_property -dict [list \
  CONFIG.ACTIVE_SIM_BD new_waveform_gen.bd \
  CONFIG.ACTIVE_SYNTH_BD new_waveform_gen.bd \
  CONFIG.ENABLE_DFX 0 \
  CONFIG.LIST_SIM_BD new_waveform_gen.bd \
  CONFIG.LIST_SYNTH_BD new_waveform_gen.bd \
  CONFIG.LOCK_PROPAGATE 0 \
] [get_bd_cells new_waveform_gen_0]
create_bd_cell -type container -reference new_waveform_gen new_waveform_gen_1
set_property -dict [list \
  CONFIG.ACTIVE_SIM_BD new_waveform_gen.bd \
  CONFIG.ACTIVE_SYNTH_BD new_waveform_gen.bd \
  CONFIG.ENABLE_DFX 0 \
  CONFIG.LIST_SIM_BD new_waveform_gen.bd \
  CONFIG.LIST_SYNTH_BD new_waveform_gen.bd \
  CONFIG.LOCK_PROPAGATE 0 \
] [get_bd_cells new_waveform_gen_1]

# ---- hierarchy /fourier_synth_standard/signal_compose/waveform_awg ----
current_bd_instance /fourier_synth_standard/signal_compose/waveform_awg
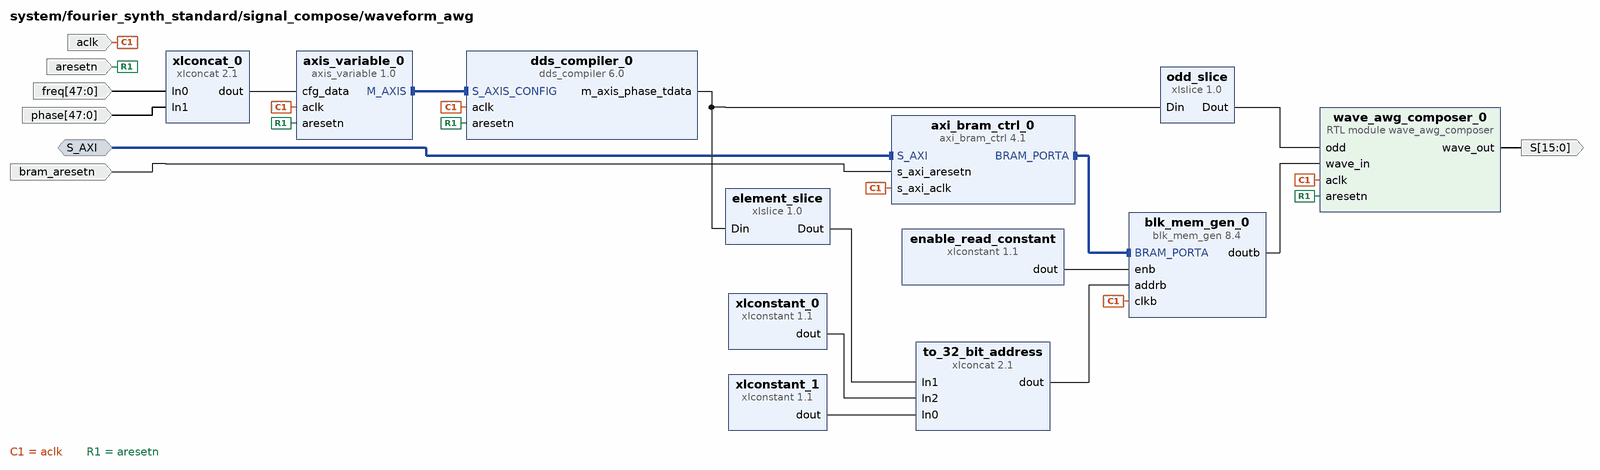
[diagram p7: block diagram inside /fourier_synth_standard/signal_compose/waveform_awg]
create_bd_intf_pin -mode Slave -vlnv xilinx.com:interface:aximm_rtl:1.0 S_AXI
create_bd_pin -dir O -from 15 -to 0 S
create_bd_pin -dir I -type clk aclk
create_bd_pin -dir I -type rst aresetn
create_bd_pin -dir I bram_aresetn
create_bd_pin -dir I -from 47 -to 0 freq
create_bd_pin -dir I -from 47 -to 0 phase

create_bd_cell -type ip -vlnv xilinx.com:ip:axi_bram_ctrl:4.1 axi_bram_ctrl_0
set_property -dict {CONFIG.SINGLE_PORT_BRAM 1} [get_bd_cells axi_bram_ctrl_0]
create_bd_cell -type ip -vlnv pavel-demin:user:axis_variable:1.0 axis_variable_0
set_property -dict {CONFIG.AXIS_TDATA_WIDTH 96} [get_bd_cells axis_variable_0]
create_bd_cell -type ip -vlnv xilinx.com:ip:blk_mem_gen:8.4 blk_mem_gen_0
set_property -dict [list \
  CONFIG.Enable_B Use_ENB_Pin \
  CONFIG.Memory_Type True_Dual_Port_RAM \
  CONFIG.Port_B_Clock 100 \
  CONFIG.Port_B_Enable_Rate 100 \
  CONFIG.Port_B_Write_Rate 50 \
  CONFIG.Use_RSTB_Pin true \
] [get_bd_cells blk_mem_gen_0]
create_bd_cell -type ip -vlnv xilinx.com:ip:dds_compiler:6.0 dds_compiler_0
set_property -dict [list \
  CONFIG.DATA_Has_TLAST Not_Required \
  CONFIG.DDS_Clock_Rate 125 \
  CONFIG.Has_ARESETn true \
  CONFIG.Latency 2 \
  CONFIG.M_DATA_Has_TUSER Not_Required \
  CONFIG.Noise_Shaping None \
  CONFIG.Output_Frequency1 0 \
  CONFIG.Output_Width 3 \
  CONFIG.Parameter_Entry Hardware_Parameters \
  CONFIG.PartsPresent Phase_Generator_only \
  CONFIG.Phase_Increment Programmable \
  CONFIG.Phase_Width 48 \
  CONFIG.Phase_offset Programmable \
  CONFIG.S_PHASE_Has_TUSER Not_Required \
] [get_bd_cells dds_compiler_0]
create_bd_cell -type ip -vlnv xilinx.com:ip:xlslice:1.0 element_slice
set_property -dict {CONFIG.DIN_FROM 47 CONFIG.DIN_TO 35 CONFIG.DIN_WIDTH 48 CONFIG.DOUT_WIDTH 13} [get_bd_cells element_slice]
create_bd_cell -type ip -vlnv xilinx.com:ip:xlconstant:1.1 enable_read_constant
create_bd_cell -type ip -vlnv xilinx.com:ip:xlslice:1.0 odd_slice
set_property -dict {CONFIG.DIN_FROM 34 CONFIG.DIN_TO 34 CONFIG.DIN_WIDTH 48 CONFIG.DOUT_WIDTH 1} [get_bd_cells odd_slice]
create_bd_cell -type ip -vlnv xilinx.com:ip:xlconcat:2.1 to_32_bit_address
set_property -dict {CONFIG.IN0_WIDTH 2 CONFIG.NUM_PORTS 3} [get_bd_cells to_32_bit_address]
create_bd_cell -type module -reference wave_awg_composer wave_awg_composer_0
create_bd_cell -type ip -vlnv xilinx.com:ip:xlconcat:2.1 xlconcat_0
set_property -dict {CONFIG.IN0_WIDTH 48} [get_bd_cells xlconcat_0]
create_bd_cell -type ip -vlnv xilinx.com:ip:xlconstant:1.1 xlconstant_0
set_property -dict {CONFIG.CONST_VAL 0 CONFIG.CONST_WIDTH 17} [get_bd_cells xlconstant_0]
create_bd_cell -type ip -vlnv xilinx.com:ip:xlconstant:1.1 xlconstant_1
set_property -dict {CONFIG.CONST_VAL 0 CONFIG.CONST_WIDTH 2} [get_bd_cells xlconstant_1]

# ---- hierarchy /fourier_synth_standard/signal_compose1 ----
current_bd_instance /fourier_synth_standard/signal_compose1
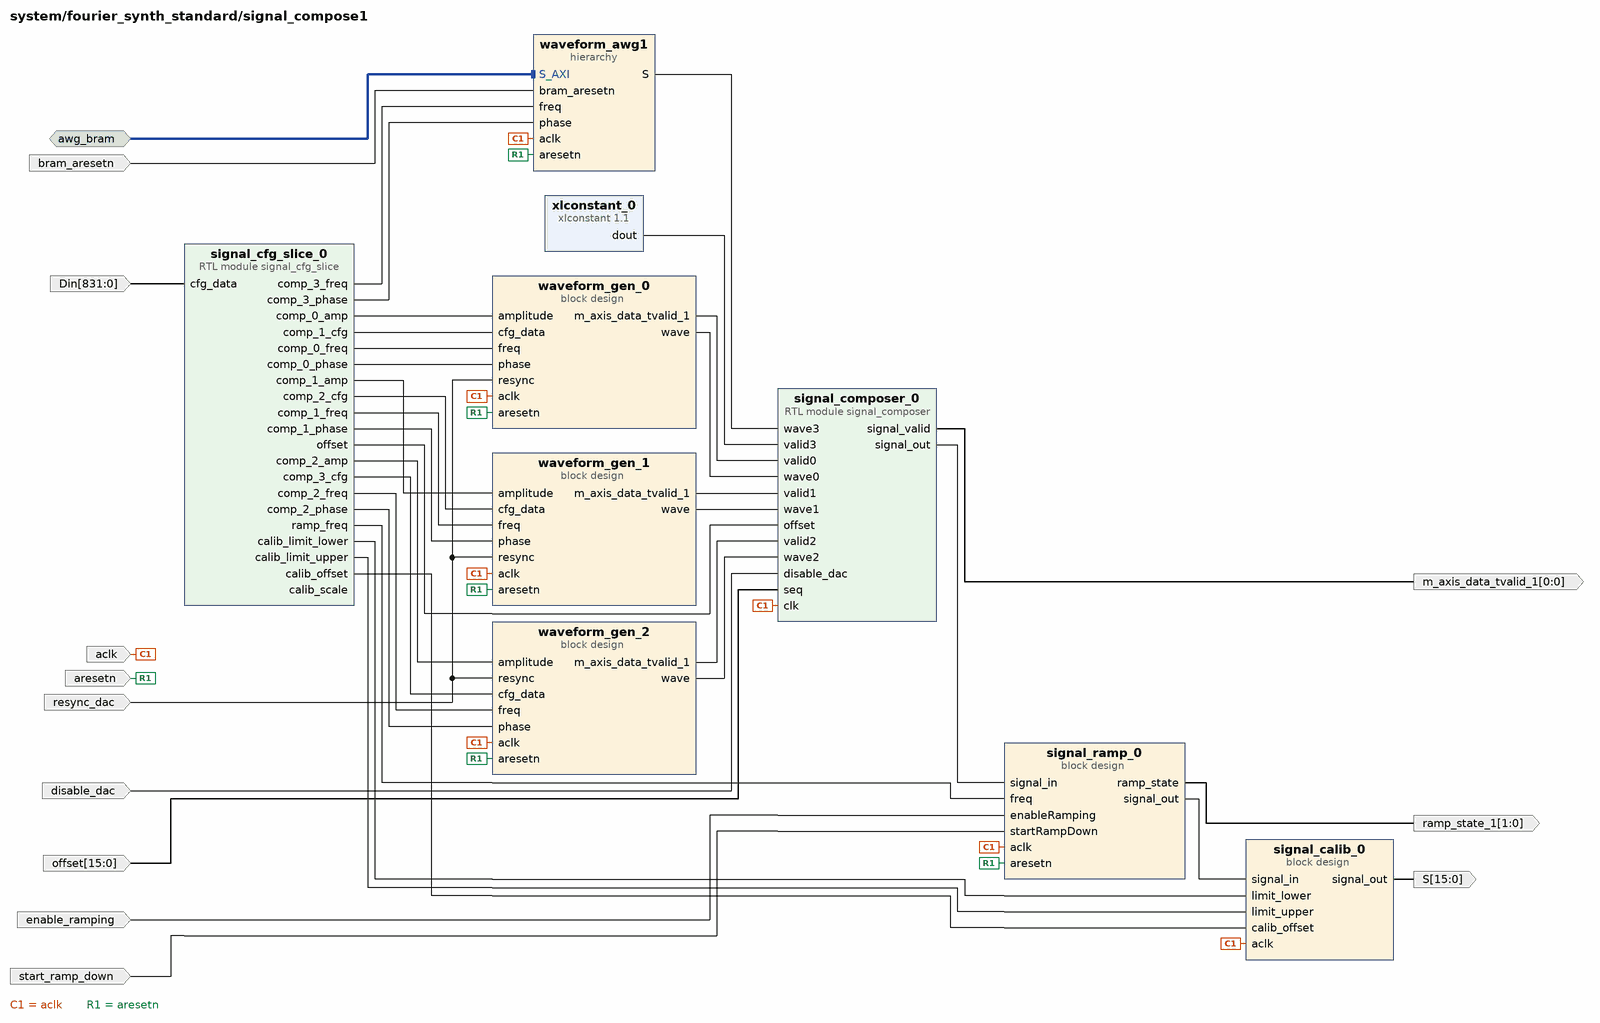
[diagram p8: block diagram inside /fourier_synth_standard/signal_compose1]
create_bd_intf_pin -mode Slave -vlnv xilinx.com:interface:aximm_rtl:1.0 awg_bram
create_bd_pin -dir I -from 831 -to 0 Din
create_bd_pin -dir O -from 15 -to 0 -type data S
create_bd_pin -dir I -type clk aclk
create_bd_pin -dir I -type rst aresetn
create_bd_pin -dir I bram_aresetn
create_bd_pin -dir I disable_dac
create_bd_pin -dir I enable_ramping
create_bd_pin -dir O -from 0 -to 0 m_axis_data_tvalid_1
create_bd_pin -dir I -from 15 -to 0 offset
create_bd_pin -dir O -from 1 -to 0 ramp_state_1
create_bd_pin -dir I resync_dac
create_bd_pin -dir I start_ramp_down

create_bd_cell -type container -reference signal_calib signal_calib_0
set_property -dict [list \
  CONFIG.ACTIVE_SIM_BD signal_calib.bd \
  CONFIG.ACTIVE_SYNTH_BD signal_calib.bd \
  CONFIG.ENABLE_DFX 0 \
  CONFIG.LIST_SIM_BD signal_calib.bd \
  CONFIG.LIST_SYNTH_BD signal_calib.bd \
  CONFIG.LOCK_PROPAGATE 0 \
] [get_bd_cells signal_calib_0]
create_bd_cell -type module -reference signal_cfg_slice signal_cfg_slice_0
create_bd_cell -type module -reference signal_composer signal_composer_0
create_bd_cell -type container -reference signal_ramp signal_ramp_0
set_property -dict [list \
  CONFIG.ACTIVE_SIM_BD signal_ramp.bd \
  CONFIG.ACTIVE_SYNTH_BD signal_ramp.bd \
  CONFIG.ENABLE_DFX 0 \
  CONFIG.LIST_SIM_BD signal_ramp.bd \
  CONFIG.LIST_SYNTH_BD signal_ramp.bd \
  CONFIG.LOCK_PROPAGATE 0 \
] [get_bd_cells signal_ramp_0]
create_bd_cell -type hier waveform_awg1
create_bd_cell -type ip -vlnv xilinx.com:ip:xlconstant:1.1 xlconstant_0
create_bd_cell -type container -reference waveform_gen waveform_gen_0
set_property -dict [list \
  CONFIG.ACTIVE_SIM_BD waveform_gen.bd \
  CONFIG.ACTIVE_SYNTH_BD waveform_gen.bd \
  CONFIG.ENABLE_DFX 0 \
  CONFIG.LIST_SIM_BD waveform_gen.bd \
  CONFIG.LIST_SYNTH_BD waveform_gen.bd \
  CONFIG.LOCK_PROPAGATE 0 \
] [get_bd_cells waveform_gen_0]
create_bd_cell -type container -reference waveform_gen waveform_gen_1
set_property -dict [list \
  CONFIG.ACTIVE_SIM_BD waveform_gen.bd \
  CONFIG.ACTIVE_SYNTH_BD waveform_gen.bd \
  CONFIG.ENABLE_DFX 0 \
  CONFIG.LIST_SIM_BD waveform_gen.bd \
  CONFIG.LIST_SYNTH_BD waveform_gen.bd \
  CONFIG.LOCK_PROPAGATE 0 \
] [get_bd_cells waveform_gen_1]
create_bd_cell -type container -reference waveform_gen waveform_gen_2
set_property -dict [list \
  CONFIG.ACTIVE_SIM_BD waveform_gen.bd \
  CONFIG.ACTIVE_SYNTH_BD waveform_gen.bd \
  CONFIG.ENABLE_DFX 0 \
  CONFIG.LIST_SIM_BD waveform_gen.bd \
  CONFIG.LIST_SYNTH_BD waveform_gen.bd \
  CONFIG.LOCK_PROPAGATE 0 \
] [get_bd_cells waveform_gen_2]

# ---- hierarchy /fourier_synth_standard/signal_compose1/waveform_awg1 ----
current_bd_instance /fourier_synth_standard/signal_compose1/waveform_awg1
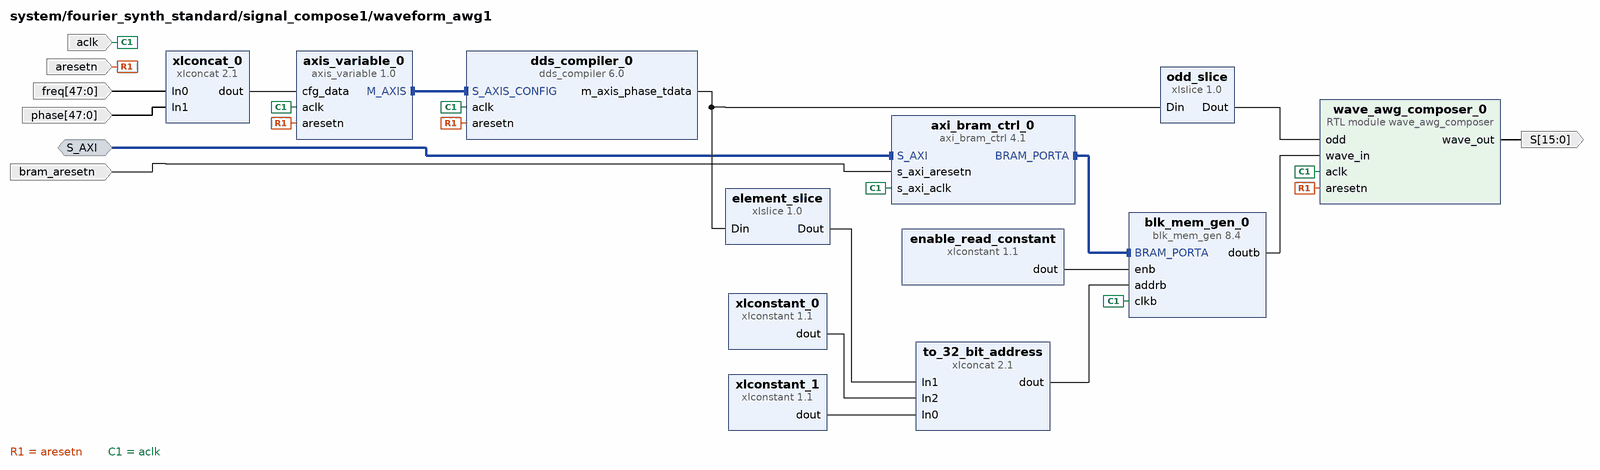
[diagram p9: block diagram inside /fourier_synth_standard/signal_compose1/waveform_awg1]
create_bd_intf_pin -mode Slave -vlnv xilinx.com:interface:aximm_rtl:1.0 S_AXI
create_bd_pin -dir O -from 15 -to 0 S
create_bd_pin -dir I -type clk aclk
create_bd_pin -dir I -type rst aresetn
create_bd_pin -dir I bram_aresetn
create_bd_pin -dir I -from 47 -to 0 freq
create_bd_pin -dir I -from 47 -to 0 phase

create_bd_cell -type ip -vlnv xilinx.com:ip:axi_bram_ctrl:4.1 axi_bram_ctrl_0
set_property -dict {CONFIG.SINGLE_PORT_BRAM 1} [get_bd_cells axi_bram_ctrl_0]
create_bd_cell -type ip -vlnv pavel-demin:user:axis_variable:1.0 axis_variable_0
set_property -dict {CONFIG.AXIS_TDATA_WIDTH 96} [get_bd_cells axis_variable_0]
create_bd_cell -type ip -vlnv xilinx.com:ip:blk_mem_gen:8.4 blk_mem_gen_0
set_property -dict [list \
  CONFIG.Enable_B Use_ENB_Pin \
  CONFIG.Memory_Type True_Dual_Port_RAM \
  CONFIG.Port_B_Clock 100 \
  CONFIG.Port_B_Enable_Rate 100 \
  CONFIG.Port_B_Write_Rate 50 \
  CONFIG.Use_RSTB_Pin true \
] [get_bd_cells blk_mem_gen_0]
create_bd_cell -type ip -vlnv xilinx.com:ip:dds_compiler:6.0 dds_compiler_0
set_property -dict [list \
  CONFIG.DATA_Has_TLAST Not_Required \
  CONFIG.DDS_Clock_Rate 125 \
  CONFIG.Has_ARESETn true \
  CONFIG.Latency 2 \
  CONFIG.M_DATA_Has_TUSER Not_Required \
  CONFIG.Noise_Shaping None \
  CONFIG.Output_Frequency1 0 \
  CONFIG.Output_Width 3 \
  CONFIG.Parameter_Entry Hardware_Parameters \
  CONFIG.PartsPresent Phase_Generator_only \
  CONFIG.Phase_Increment Programmable \
  CONFIG.Phase_Width 48 \
  CONFIG.Phase_offset Programmable \
  CONFIG.S_PHASE_Has_TUSER Not_Required \
] [get_bd_cells dds_compiler_0]
create_bd_cell -type ip -vlnv xilinx.com:ip:xlslice:1.0 element_slice
set_property -dict {CONFIG.DIN_FROM 47 CONFIG.DIN_TO 35 CONFIG.DIN_WIDTH 48 CONFIG.DOUT_WIDTH 13} [get_bd_cells element_slice]
create_bd_cell -type ip -vlnv xilinx.com:ip:xlconstant:1.1 enable_read_constant
create_bd_cell -type ip -vlnv xilinx.com:ip:xlslice:1.0 odd_slice
set_property -dict {CONFIG.DIN_FROM 34 CONFIG.DIN_TO 34 CONFIG.DIN_WIDTH 48 CONFIG.DOUT_WIDTH 1} [get_bd_cells odd_slice]
create_bd_cell -type ip -vlnv xilinx.com:ip:xlconcat:2.1 to_32_bit_address
set_property -dict {CONFIG.IN0_WIDTH 2 CONFIG.NUM_PORTS 3} [get_bd_cells to_32_bit_address]
create_bd_cell -type module -reference wave_awg_composer wave_awg_composer_0
create_bd_cell -type ip -vlnv xilinx.com:ip:xlconcat:2.1 xlconcat_0
set_property -dict {CONFIG.IN0_WIDTH 48} [get_bd_cells xlconcat_0]
create_bd_cell -type ip -vlnv xilinx.com:ip:xlconstant:1.1 xlconstant_0
set_property -dict {CONFIG.CONST_VAL 0 CONFIG.CONST_WIDTH 17} [get_bd_cells xlconstant_0]
create_bd_cell -type ip -vlnv xilinx.com:ip:xlconstant:1.1 xlconstant_1
set_property -dict {CONFIG.CONST_VAL 0 CONFIG.CONST_WIDTH 2} [get_bd_cells xlconstant_1]

# ---- hierarchy /sequencer ----
current_bd_instance /sequencer
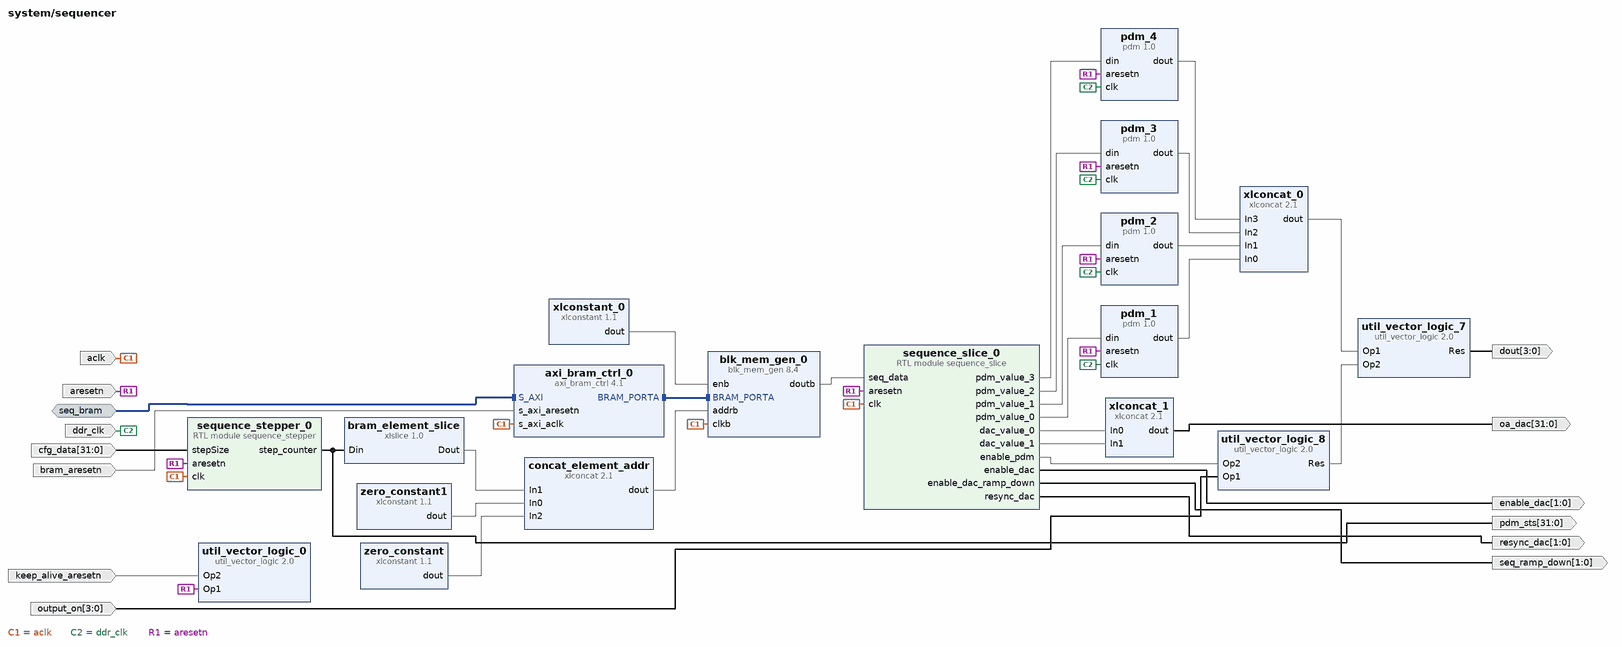
[diagram p10: block diagram inside /sequencer]
create_bd_intf_pin -mode Slave -vlnv xilinx.com:interface:aximm_rtl:1.0 seq_bram
create_bd_pin -dir I -type clk aclk
create_bd_pin -dir I -type rst aresetn
create_bd_pin -dir I bram_aresetn
create_bd_pin -dir I -from 31 -to 0 cfg_data
create_bd_pin -dir I -type clk ddr_clk
create_bd_pin -dir O -from 3 -to 0 dout
create_bd_pin -dir O -from 1 -to 0 enable_dac
create_bd_pin -dir I -type rst keep_alive_aresetn
create_bd_pin -dir O -from 31 -to 0 oa_dac
create_bd_pin -dir I -from 3 -to 0 output_on
create_bd_pin -dir O -from 31 -to 0 pdm_sts
create_bd_pin -dir O -from 1 -to 0 resync_dac
create_bd_pin -dir O -from 1 -to 0 seq_ramp_down

create_bd_cell -type ip -vlnv xilinx.com:ip:axi_bram_ctrl:4.1 axi_bram_ctrl_0
set_property -dict {CONFIG.DATA_WIDTH 128 CONFIG.PROTOCOL AXI4 CONFIG.SINGLE_PORT_BRAM 1} [get_bd_cells axi_bram_ctrl_0]
create_bd_cell -type ip -vlnv xilinx.com:ip:blk_mem_gen:8.4 blk_mem_gen_0
set_property -dict [list \
  CONFIG.EN_SAFETY_CKT true \
  CONFIG.Enable_32bit_Address true \
  CONFIG.Enable_B Use_ENB_Pin \
  CONFIG.Memory_Type True_Dual_Port_RAM \
  CONFIG.Operating_Mode_A WRITE_FIRST \
  CONFIG.Port_A_Write_Rate 50 \
  CONFIG.Port_B_Clock 100 \
  CONFIG.Port_B_Enable_Rate 100 \
  CONFIG.Port_B_Write_Rate 50 \
  CONFIG.Read_Width_A 128 \
  CONFIG.Read_Width_B 128 \
  CONFIG.Register_PortA_Output_of_Memory_Primitives false \
  CONFIG.Register_PortB_Output_of_Memory_Primitives false \
  CONFIG.Use_RSTA_Pin true \
  CONFIG.Use_RSTB_Pin true \
  CONFIG.Write_Width_A 128 \
  CONFIG.Write_Width_B 128 \
  CONFIG.use_bram_block BRAM_Controller \
] [get_bd_cells blk_mem_gen_0]
create_bd_cell -type ip -vlnv xilinx.com:ip:xlslice:1.0 bram_element_slice
set_property -dict {CONFIG.DIN_FROM 12 CONFIG.DOUT_WIDTH 13} [get_bd_cells bram_element_slice]
create_bd_cell -type ip -vlnv xilinx.com:ip:xlconcat:2.1 concat_element_addr
set_property -dict {CONFIG.NUM_PORTS 3} [get_bd_cells concat_element_addr]
create_bd_cell -type ip -vlnv koheron:user:pdm:1.0 pdm_1
create_bd_cell -type ip -vlnv koheron:user:pdm:1.0 pdm_2
create_bd_cell -type ip -vlnv koheron:user:pdm:1.0 pdm_3
create_bd_cell -type ip -vlnv koheron:user:pdm:1.0 pdm_4
create_bd_cell -type module -reference sequence_slice sequence_slice_0
create_bd_cell -type module -reference sequence_stepper sequence_stepper_0
create_bd_cell -type ip -vlnv xilinx.com:ip:util_vector_logic:2.0 util_vector_logic_0
set_property -dict {CONFIG.C_OPERATION or CONFIG.C_SIZE 1} [get_bd_cells util_vector_logic_0]
create_bd_cell -type ip -vlnv xilinx.com:ip:util_vector_logic:2.0 util_vector_logic_7
set_property -dict {CONFIG.C_SIZE 4} [get_bd_cells util_vector_logic_7]
create_bd_cell -type ip -vlnv xilinx.com:ip:util_vector_logic:2.0 util_vector_logic_8
set_property -dict {CONFIG.C_SIZE 4} [get_bd_cells util_vector_logic_8]
create_bd_cell -type ip -vlnv xilinx.com:ip:xlconcat:2.1 xlconcat_0
set_property -dict {CONFIG.NUM_PORTS 4} [get_bd_cells xlconcat_0]
create_bd_cell -type ip -vlnv xilinx.com:ip:xlconcat:2.1 xlconcat_1
create_bd_cell -type ip -vlnv xilinx.com:ip:xlconstant:1.1 xlconstant_0
create_bd_cell -type ip -vlnv xilinx.com:ip:xlconstant:1.1 zero_constant
set_property -dict {CONFIG.CONST_VAL 0 CONFIG.CONST_WIDTH 15} [get_bd_cells zero_constant]
create_bd_cell -type ip -vlnv xilinx.com:ip:xlconstant:1.1 zero_constant1
set_property -dict {CONFIG.CONST_VAL 0 CONFIG.CONST_WIDTH 4} [get_bd_cells zero_constant1]

# ---- hierarchy /system ----
current_bd_instance /system
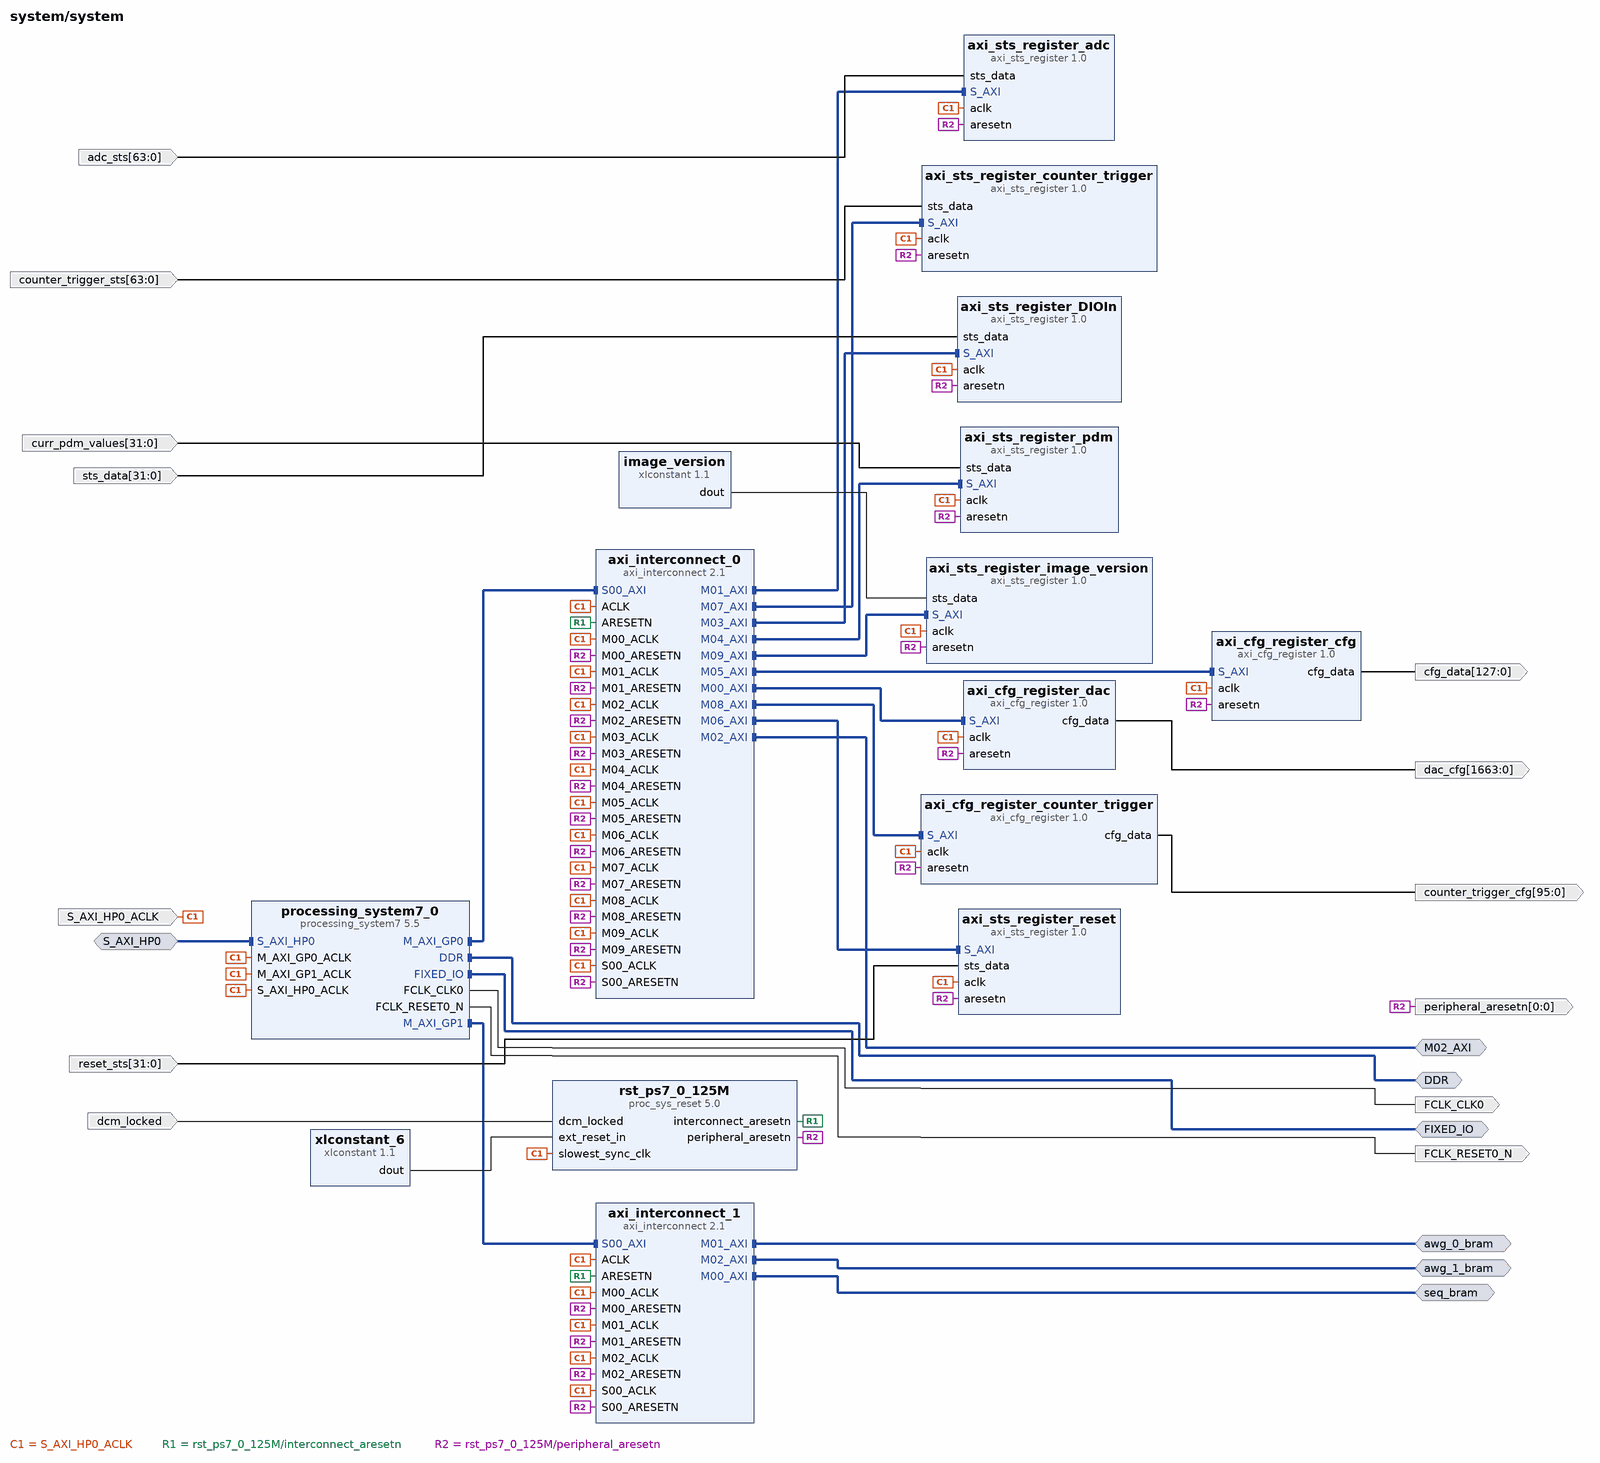
[diagram p11: block diagram inside /system]
create_bd_intf_pin -mode Master -vlnv xilinx.com:interface:ddrx_rtl:1.0 DDR
create_bd_intf_pin -mode Master -vlnv xilinx.com:display_processing_system7:fixedio_rtl:1.0 FIXED_IO
create_bd_intf_pin -mode Master -vlnv xilinx.com:interface:aximm_rtl:1.0 M02_AXI
create_bd_intf_pin -mode Slave -vlnv xilinx.com:interface:aximm_rtl:1.0 S_AXI_HP0
create_bd_intf_pin -mode Master -vlnv xilinx.com:interface:aximm_rtl:1.0 awg_0_bram
create_bd_intf_pin -mode Master -vlnv xilinx.com:interface:aximm_rtl:1.0 awg_1_bram
create_bd_intf_pin -mode Master -vlnv xilinx.com:interface:aximm_rtl:1.0 seq_bram
create_bd_pin -dir O -type clk FCLK_CLK0
create_bd_pin -dir O -type rst FCLK_RESET0_N
create_bd_pin -dir I -type clk S_AXI_HP0_ACLK
create_bd_pin -dir I -from 63 -to 0 adc_sts
create_bd_pin -dir O -from 127 -to 0 cfg_data
create_bd_pin -dir O -from 95 -to 0 counter_trigger_cfg
create_bd_pin -dir I -from 63 -to 0 counter_trigger_sts
create_bd_pin -dir I -from 31 -to 0 curr_pdm_values
create_bd_pin -dir O -from 1663 -to 0 dac_cfg
create_bd_pin -dir I dcm_locked
create_bd_pin -dir O -from 0 -to 0 -type rst peripheral_aresetn
create_bd_pin -dir I -from 31 -to 0 reset_sts
create_bd_pin -dir I -from 31 -to 0 sts_data

create_bd_cell -type ip -vlnv pavel-demin:user:axi_cfg_register:1.0 axi_cfg_register_cfg
set_property -dict {CONFIG.AXI_ADDR_WIDTH 32 CONFIG.CFG_DATA_WIDTH 128} [get_bd_cells axi_cfg_register_cfg]
create_bd_cell -type ip -vlnv pavel-demin:user:axi_cfg_register:1.0 axi_cfg_register_counter_trigger
set_property -dict {CONFIG.AXI_ADDR_WIDTH 32 CONFIG.CFG_DATA_WIDTH 96} [get_bd_cells axi_cfg_register_counter_trigger]
create_bd_cell -type ip -vlnv pavel-demin:user:axi_cfg_register:1.0 axi_cfg_register_dac
set_property -dict {CONFIG.AXI_ADDR_WIDTH 32 CONFIG.CFG_DATA_WIDTH 1664} [get_bd_cells axi_cfg_register_dac]
create_bd_cell -type ip -vlnv xilinx.com:ip:axi_interconnect:2.1 axi_interconnect_0
set_property -dict {CONFIG.NUM_MI 10} [get_bd_cells axi_interconnect_0]
create_bd_cell -type ip -vlnv xilinx.com:ip:axi_interconnect:2.1 axi_interconnect_1
set_property -dict [list \
  CONFIG.M01_HAS_DATA_FIFO 1 \
  CONFIG.M02_HAS_DATA_FIFO 1 \
  CONFIG.NUM_MI 3 \
  CONFIG.S00_HAS_DATA_FIFO 2 \
  CONFIG.STRATEGY 2 \
] [get_bd_cells axi_interconnect_1]
create_bd_cell -type ip -vlnv pavel-demin:user:axi_sts_register:1.0 axi_sts_register_DIOIn
set_property -dict {CONFIG.AXI_ADDR_WIDTH 32 CONFIG.STS_DATA_WIDTH 32} [get_bd_cells axi_sts_register_DIOIn]
create_bd_cell -type ip -vlnv pavel-demin:user:axi_sts_register:1.0 axi_sts_register_adc
set_property -dict {CONFIG.AXI_ADDR_WIDTH 32 CONFIG.STS_DATA_WIDTH 64} [get_bd_cells axi_sts_register_adc]
create_bd_cell -type ip -vlnv pavel-demin:user:axi_sts_register:1.0 axi_sts_register_counter_trigger
set_property -dict {CONFIG.AXI_ADDR_WIDTH 32 CONFIG.STS_DATA_WIDTH 64} [get_bd_cells axi_sts_register_counter_trigger]
create_bd_cell -type ip -vlnv pavel-demin:user:axi_sts_register:1.0 axi_sts_register_image_version
set_property -dict {CONFIG.AXI_ADDR_WIDTH 32 CONFIG.STS_DATA_WIDTH 32} [get_bd_cells axi_sts_register_image_version]
create_bd_cell -type ip -vlnv pavel-demin:user:axi_sts_register:1.0 axi_sts_register_pdm
set_property -dict {CONFIG.AXI_ADDR_WIDTH 32 CONFIG.STS_DATA_WIDTH 32} [get_bd_cells axi_sts_register_pdm]
create_bd_cell -type ip -vlnv pavel-demin:user:axi_sts_register:1.0 axi_sts_register_reset
set_property -dict {CONFIG.AXI_ADDR_WIDTH 32 CONFIG.STS_DATA_WIDTH 32} [get_bd_cells axi_sts_register_reset]
create_bd_cell -type ip -vlnv xilinx.com:ip:xlconstant:1.1 image_version
set_property -dict {CONFIG.CONST_VAL 11 CONFIG.CONST_WIDTH 32} [get_bd_cells image_version]
create_bd_cell -type ip -vlnv xilinx.com:ip:processing_system7:5.5 processing_system7_0
set_property -dict [list \
  CONFIG.PCW_APU_PERIPHERAL_FREQMHZ 666.666666 \
  CONFIG.PCW_ENET0_PERIPHERAL_ENABLE 0 \
  CONFIG.PCW_FPGA0_PERIPHERAL_FREQMHZ 50 \
  CONFIG.PCW_FPGA1_PERIPHERAL_FREQMHZ 50 \
  CONFIG.PCW_GPIO_MIO_GPIO_ENABLE 0 \
  CONFIG.PCW_IMPORT_BOARD_PRESET cfg/red_pitaya.xml \
  CONFIG.PCW_PRESET_BANK1_VOLTAGE {LVCMOS 3.3V} \
  CONFIG.PCW_QSPI_PERIPHERAL_ENABLE 0 \
  CONFIG.PCW_SD0_PERIPHERAL_ENABLE 0 \
  CONFIG.PCW_UART1_PERIPHERAL_ENABLE 0 \
  CONFIG.PCW_UIPARAM_DDR_FREQ_MHZ 533.333333 \
  CONFIG.PCW_UIPARAM_DDR_PARTNO {MT41J128M8 JP-125} \
  CONFIG.PCW_USB0_PERIPHERAL_ENABLE 0 \
  CONFIG.PCW_USE_M_AXI_GP1 1 \
  CONFIG.PCW_USE_S_AXI_HP0 1 \
] [get_bd_cells processing_system7_0]
# 270 more settings of processing_system7_0 are not shown: defaults, MIO pin electricals, DDR timing, and values the tool derives
create_bd_cell -type ip -vlnv xilinx.com:ip:proc_sys_reset:5.0 rst_ps7_0_125M
create_bd_cell -type ip -vlnv xilinx.com:ip:xlconstant:1.1 xlconstant_6
